# EasyEDA Pro project H7MS-H735-R4B-delivery-20261017.epro, schematic H7MS_CORE_H735_A1_核心板原理图, sheets 8 to 10 of 11

## Sheets
8 C07_板间连接器与测试点: Create Date: 2026-10-17; Update Date: 2026-10-17; Version: Draft_0.10
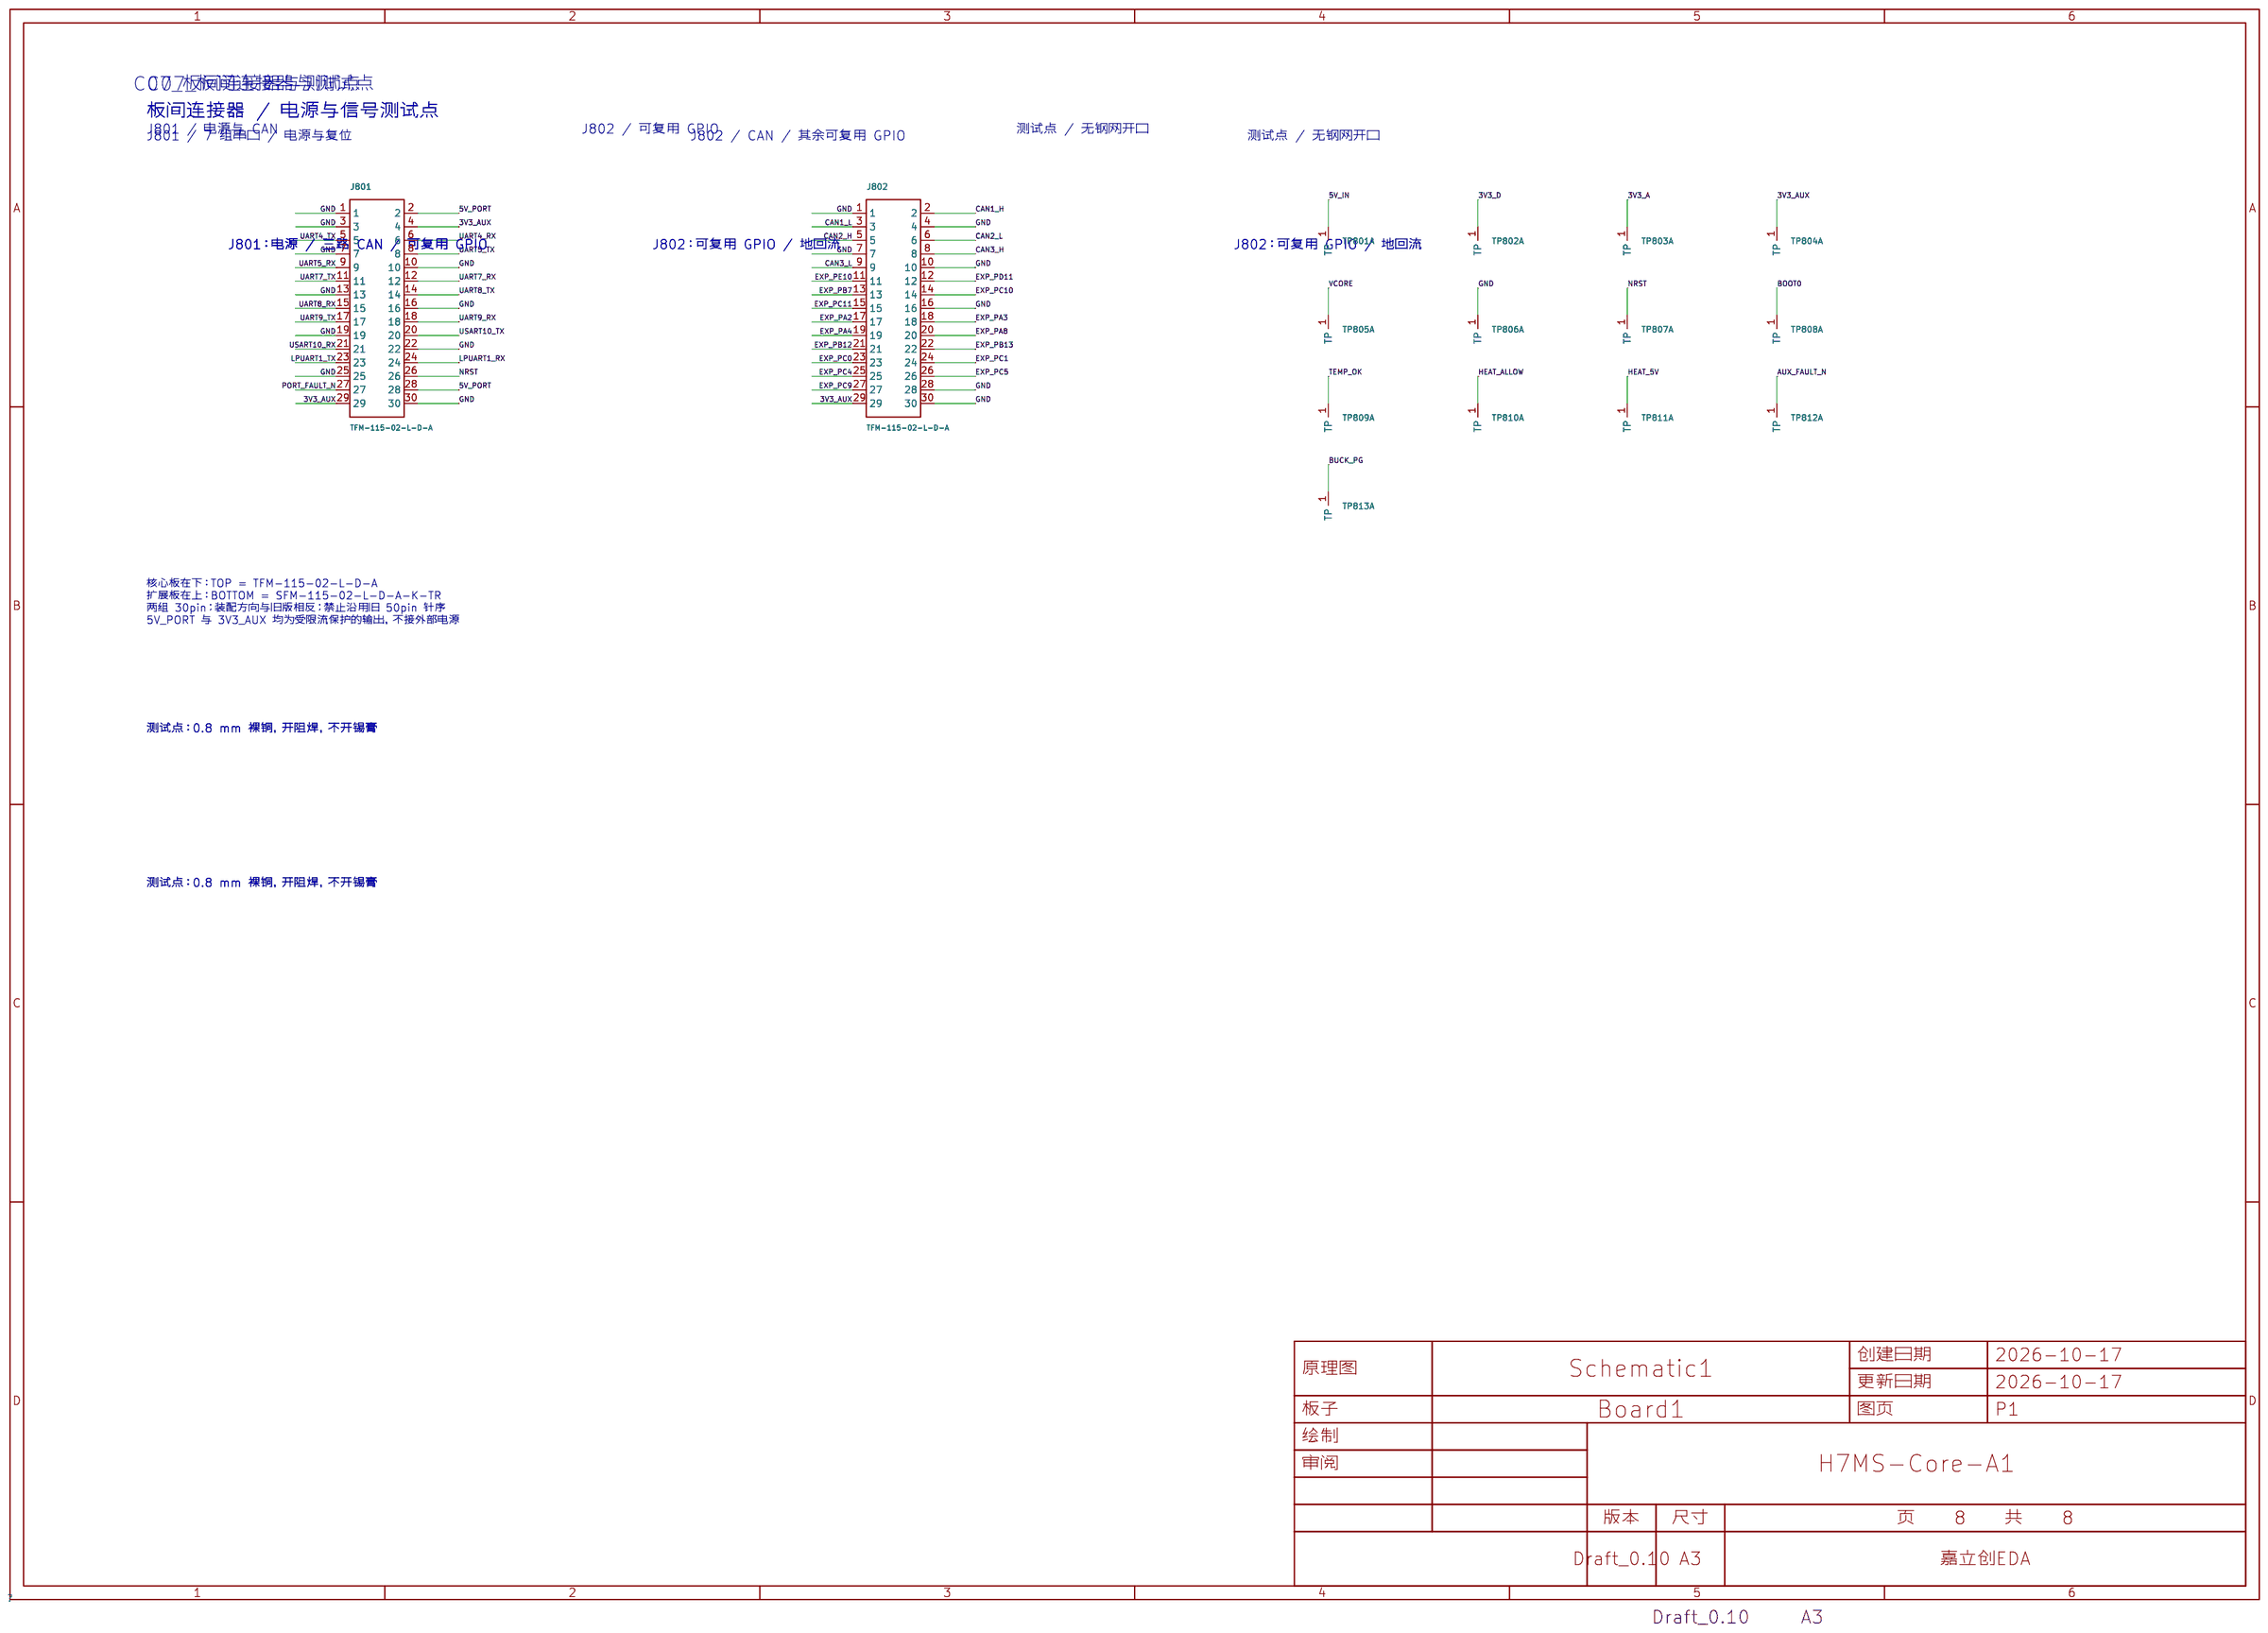
[diagram p7: C07_板间连接器与测试点]
9 C08_四组UART直立接口: Board Name: CORE_H735核心板; Create Date: 2026-10-17; Schematic Name: H7MS_CORE_H735_A1_核心板原理图; Update Date: 2026-10-17; Page Size: A4; Version: V1.0
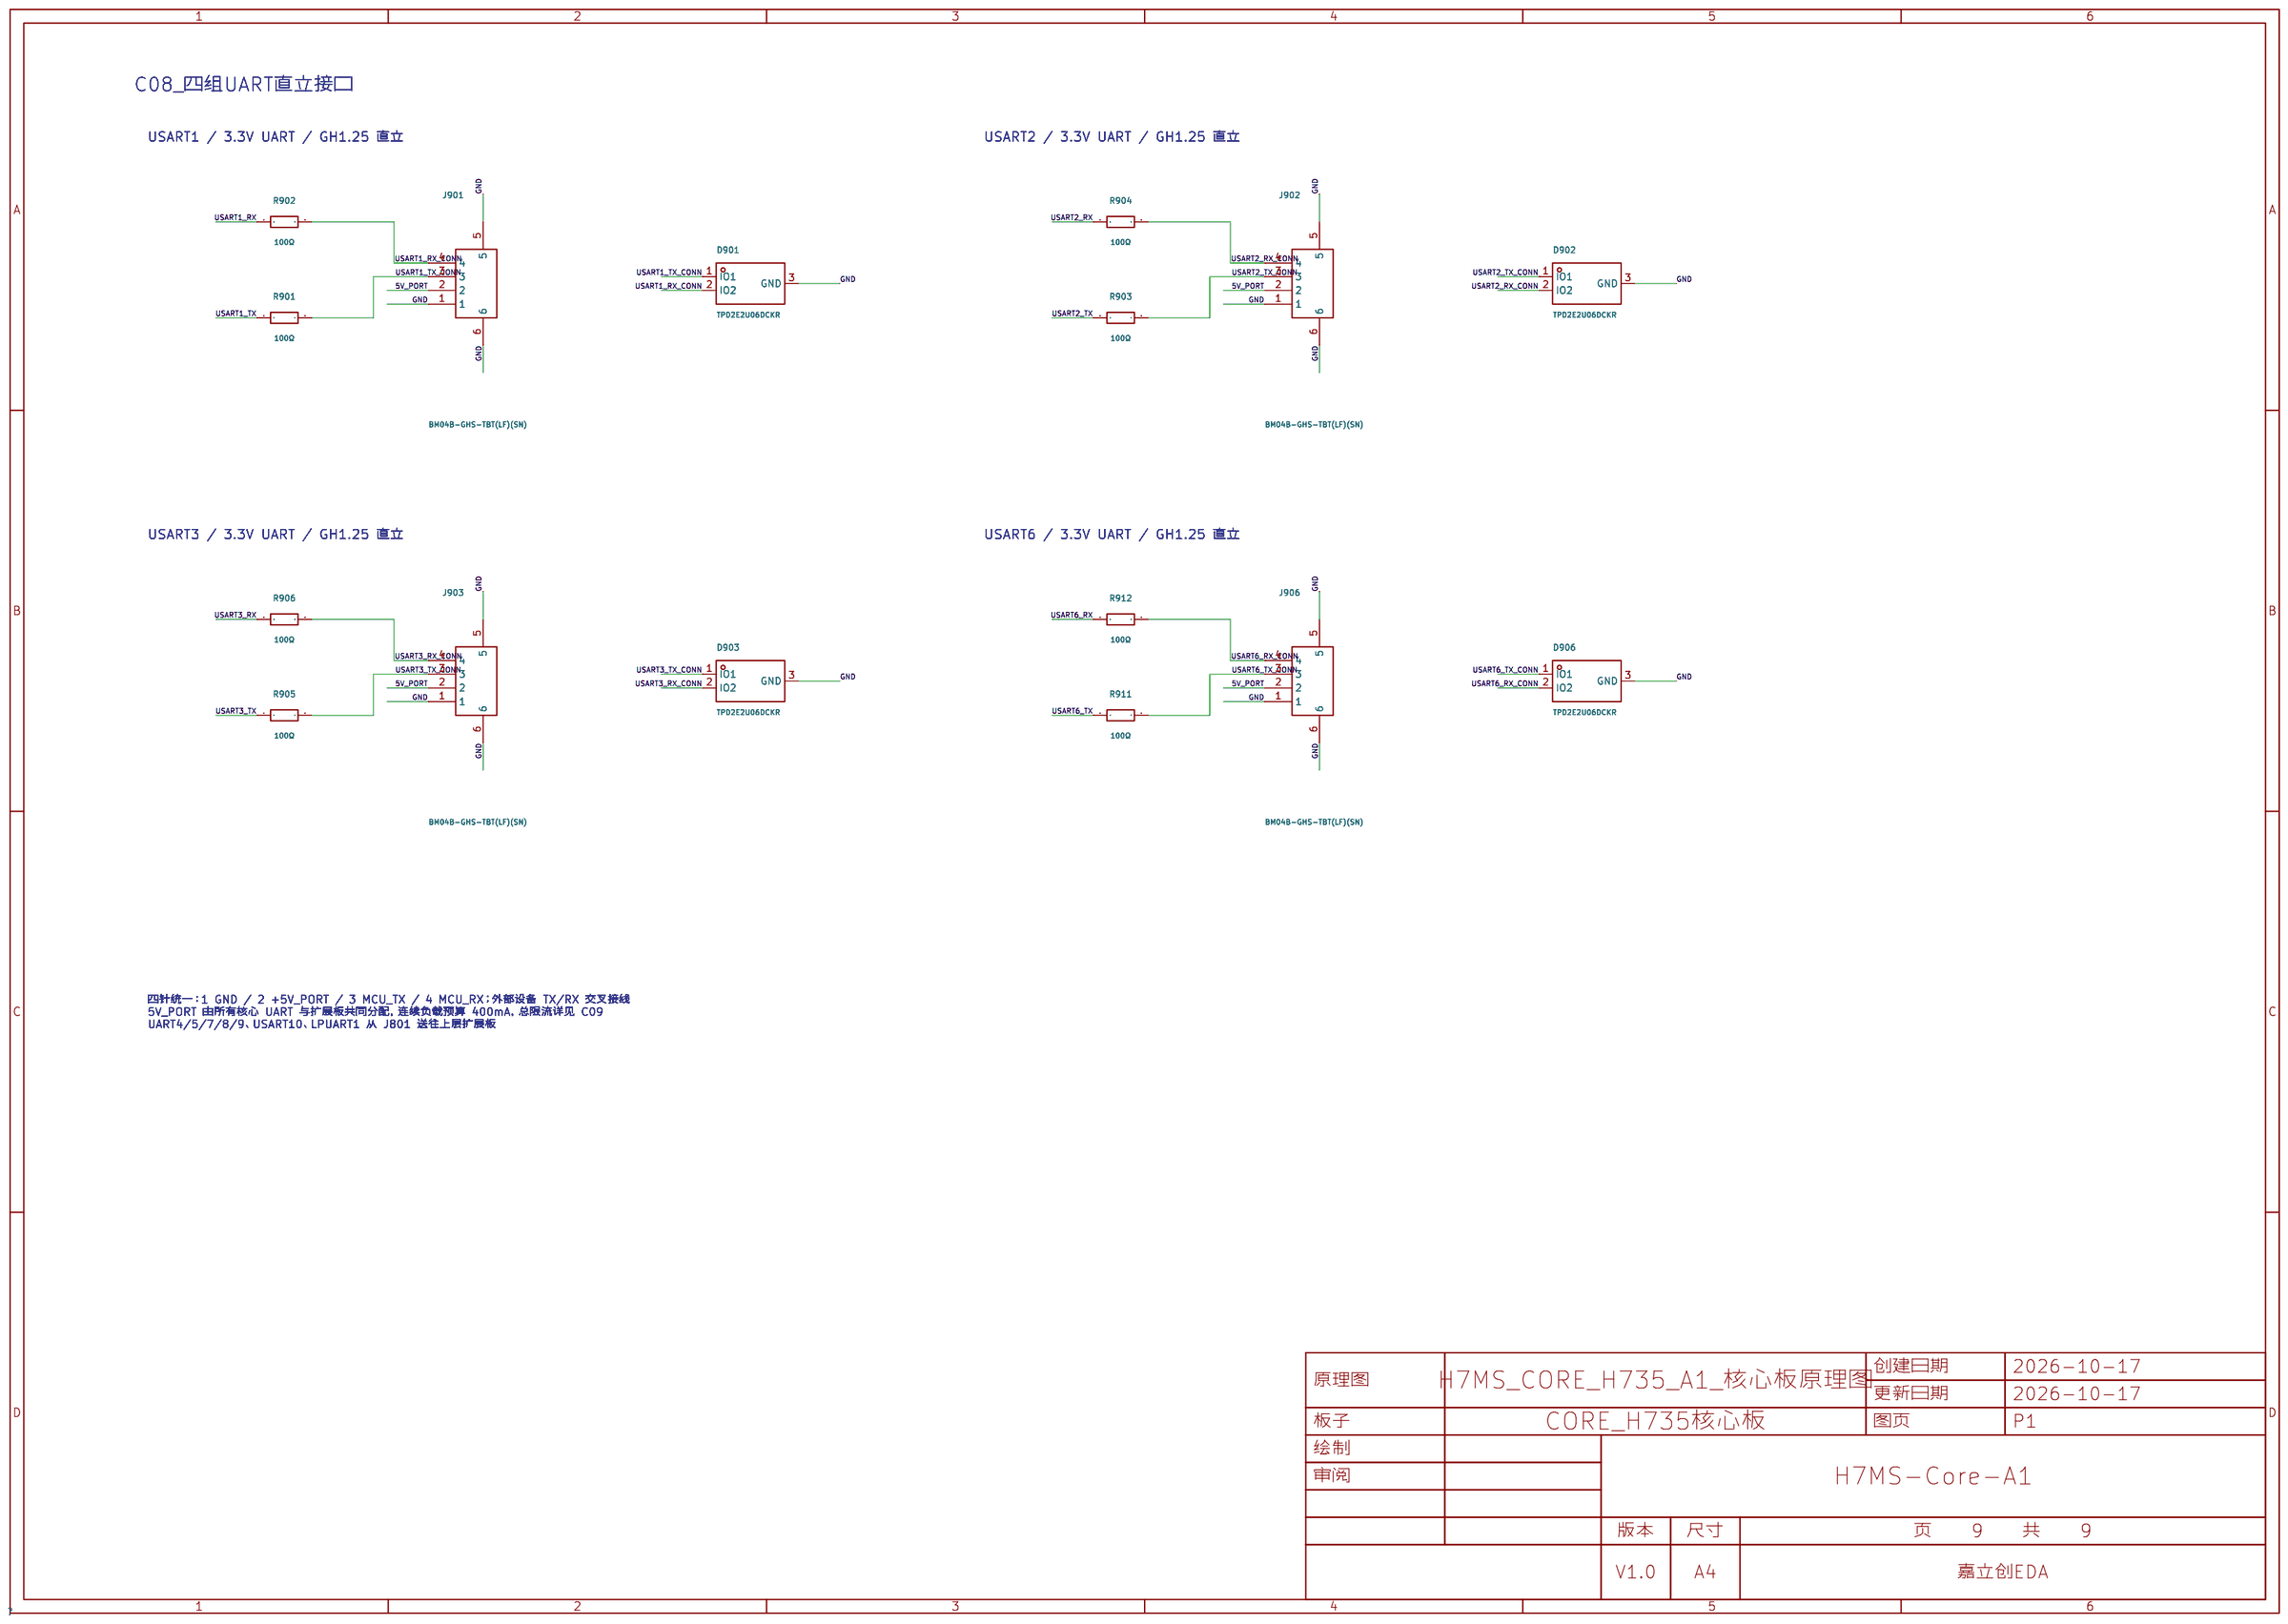
[diagram p8: C08_四组UART直立接口]
10 C09_SPI_I2C自定义排针与接口供电: Board Name: CORE_H735核心板; Create Date: 2026-10-17; Schematic Name: H7MS_CORE_H735_A1_核心板原理图; Update Date: 2026-10-17; Page Size: A4; Version: V1.0
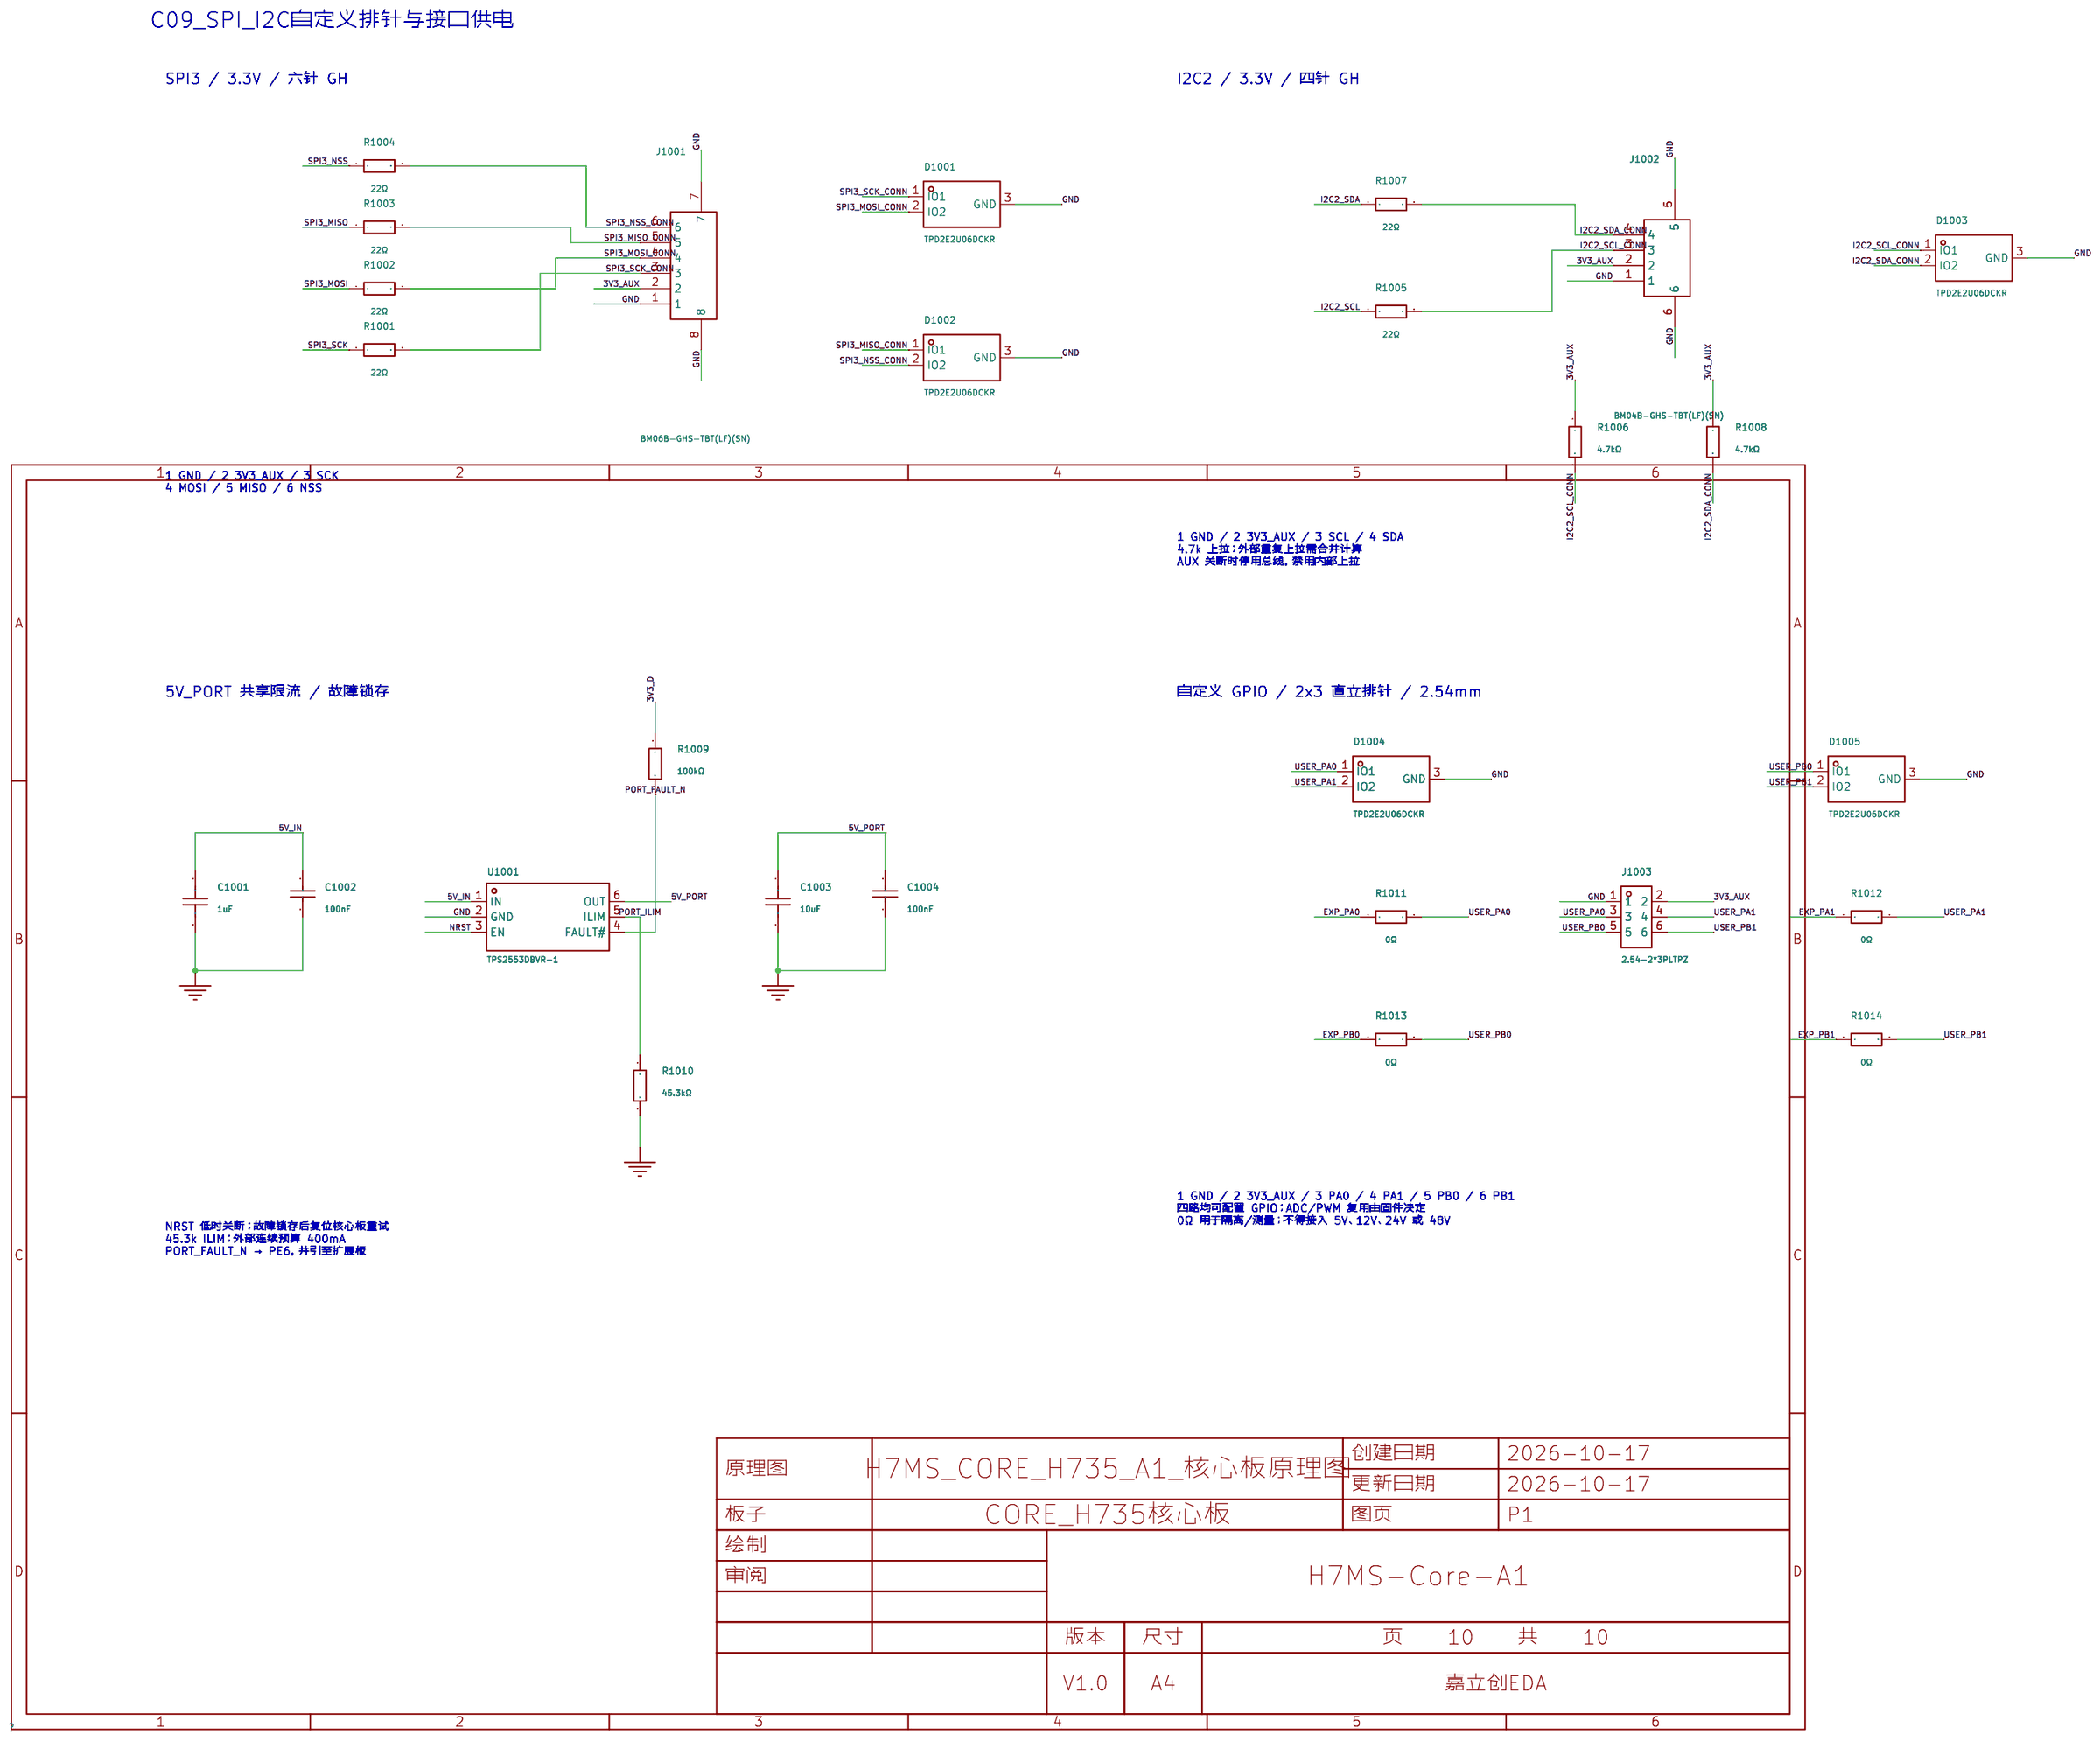
[diagram p9: C09_SPI_I2C自定义排针与接口供电]

## Parts
sheet C07_板间连接器与测试点
J801  TFM-115-02-L-D-A  [CONN-SMD_TFM-115-02-L-D-A]
J802  TFM-115-02-L-D-A  [CONN-SMD_TFM-115-02-L-D-A]
TP801  PCB_TP_0.8  [H7MS_TP_0p8_NOMASKPASTE]  (section 1)  (no BOM)
TP802  PCB_TP_0.8  [H7MS_TP_0p8_NOMASKPASTE]  (section 1)  (no BOM)
TP803  PCB_TP_0.8  [H7MS_TP_0p8_NOMASKPASTE]  (section 1)  (no BOM)
TP804  PCB_TP_0.8  [H7MS_TP_0p8_NOMASKPASTE]  (section 1)  (no BOM)
TP805  PCB_TP_0.8  [H7MS_TP_0p8_NOMASKPASTE]  (section 1)  (no BOM)
TP806  PCB_TP_0.8  [H7MS_TP_0p8_NOMASKPASTE]  (section 1)  (no BOM)
TP807  PCB_TP_0.8  [H7MS_TP_0p8_NOMASKPASTE]  (section 1)  (no BOM)
TP808  PCB_TP_0.8  [H7MS_TP_0p8_NOMASKPASTE]  (section 1)  (no BOM)
TP809  PCB_TP_0.8  [H7MS_TP_0p8_NOMASKPASTE]  (section 1)  (no BOM)
TP810  PCB_TP_0.8  [H7MS_TP_0p8_NOMASKPASTE]  (section 1)  (no BOM)
TP811  PCB_TP_0.8  [H7MS_TP_0p8_NOMASKPASTE]  (section 1)  (no BOM)
TP812  PCB_TP_0.8  [H7MS_TP_0p8_NOMASKPASTE]  (section 1)  (no BOM)
TP813  PCB_TP_0.8  [H7MS_TP_0p8_NOMASKPASTE]  (section 1)  (no BOM)
sheet C08_四组UART直立接口
D901  TPD2E2U06DCKR  [SC-70-3_L2.0-W1.3-P0.65-LS2.1-BL]
D902  TPD2E2U06DCKR  [SC-70-3_L2.0-W1.3-P0.65-LS2.1-BL]
D903  TPD2E2U06DCKR  [SC-70-3_L2.0-W1.3-P0.65-LS2.1-BL]
D906  TPD2E2U06DCKR  [SC-70-3_L2.0-W1.3-P0.65-LS2.1-BL]
J901  BM04B-GHS-TBT(LF)(SN)  [CONN-SMD_4P-P1.25_BM04B-GHS-TBT-LF-SN]
J902  BM04B-GHS-TBT(LF)(SN)  [CONN-SMD_4P-P1.25_BM04B-GHS-TBT-LF-SN]
J903  BM04B-GHS-TBT(LF)(SN)  [CONN-SMD_4P-P1.25_BM04B-GHS-TBT-LF-SN]
J906  BM04B-GHS-TBT(LF)(SN)  [CONN-SMD_4P-P1.25_BM04B-GHS-TBT-LF-SN]
R901  100Ω  [R0402]
R902  100Ω  [R0402]
R903  100Ω  [R0402]
R904  100Ω  [R0402]
R905  100Ω  [R0402]
R906  100Ω  [R0402]
R911  100Ω  [R0402]
R912  100Ω  [R0402]
sheet C09_SPI_I2C自定义排针与接口供电
C1001  1uF  [C0603]
C1002  100nF  [C0402]
C1003  10uF  [C0805]
C1004  100nF  [C0402]
D1001  TPD2E2U06DCKR  [SC-70-3_L2.0-W1.3-P0.65-LS2.1-BL]
D1002  TPD2E2U06DCKR  [SC-70-3_L2.0-W1.3-P0.65-LS2.1-BL]
D1003  TPD2E2U06DCKR  [SC-70-3_L2.0-W1.3-P0.65-LS2.1-BL]
D1004  TPD2E2U06DCKR  [SC-70-3_L2.0-W1.3-P0.65-LS2.1-BL]
D1005  TPD2E2U06DCKR  [SC-70-3_L2.0-W1.3-P0.65-LS2.1-BL]
J1001  BM06B-GHS-TBT(LF)(SN)  [CONN-SMD_6P-P1.25_BM06B-GHS-TBT-LF-SN-N]
J1002  BM04B-GHS-TBT(LF)(SN)  [CONN-SMD_4P-P1.25_BM04B-GHS-TBT-LF-SN]
J1003  2.54-2*3PLTPZ  [HDR-SMD_6P-P2.54-V-M-R2-C3-LS7.5-2]
R1001  22Ω  [R0402]
R1002  22Ω  [R0402]
R1003  22Ω  [R0402]
R1004  22Ω  [R0402]
R1005  22Ω  [R0402]
R1006  4.7kΩ  [R0402]
R1007  22Ω  [R0402]
R1008  4.7kΩ  [R0402]
R1009  100kΩ  [R0402]
R1010  45.3kΩ  [R0402]
R1011  0Ω  [R0402]
R1012  0Ω  [R0402]
R1013  0Ω  [R0402]
R1014  0Ω  [R0402]
U1001  TPS2553DBVR-1  [SOT-23-6_L2.9-W1.6-P0.95-LS2.8-BL]

## Library data of the parts
J801 = TFM-115-02-L-D-A: 插针结构:2x15P;间距:1.27mm;安装方式:立贴;总PIN数:30P;排数:2;每排PIN数:15;行距:1.27mm;额定电流:3.2A;触头材质:磷青铜;触头镀层:锡;工作温度:-55℃~+125℃;; LCSC Part Name: 2x15P 间距:1.27mm 立贴; Supplier Part: C5714577; Manufacturer: SAMTEC; Supplier Footprint: SMD,P=1.27mm; JLCPCB Part Class: Extended Part; Datasheet: https://item.szlcsc.com/datasheet/TFM-115-02-L-D-A/6638434.html; Supplier: LCSC; Pins Structure: 2x15P; Pitch: 1.27mm; Mounting Type: 立贴; Number of Pins: 30P; Number of Rows: 2; Number of PINs Per Row: 15; Row Spacing: 1.27mm; Current Rating: 3.2A; Contact Material: 磷青铜; Contact Plating: 锡; Operating Temperature: -55℃~+125℃; Voltage Rating: 250V; Plastic Material: LCP; Flame Retardant Rating: UL94V-0; Color: 黑色; Z-Height of the Board: 5.72mm; X-Length of Bottom Edge on Board (Spacing Line): 22.23mm; Y-Width of Bottom Edge on Board: 5.72mm; H7MS_Function: J1; H7MS_Revision: R4; H7MS_Assembly: FIT
J802 = TFM-115-02-L-D-A: 插针结构:2x15P;间距:1.27mm;安装方式:立贴;总PIN数:30P;排数:2;每排PIN数:15;行距:1.27mm;额定电流:3.2A;触头材质:磷青铜;触头镀层:锡;工作温度:-55℃~+125℃;; LCSC Part Name: 2x15P 间距:1.27mm 立贴; Supplier Part: C5714577; Manufacturer: SAMTEC; Supplier Footprint: SMD,P=1.27mm; JLCPCB Part Class: Extended Part; Datasheet: https://item.szlcsc.com/datasheet/TFM-115-02-L-D-A/6638434.html; Supplier: LCSC; Pins Structure: 2x15P; Pitch: 1.27mm; Mounting Type: 立贴; Number of Pins: 30P; Number of Rows: 2; Number of PINs Per Row: 15; Row Spacing: 1.27mm; Current Rating: 3.2A; Contact Material: 磷青铜; Contact Plating: 锡; Operating Temperature: -55℃~+125℃; Voltage Rating: 250V; Plastic Material: LCP; Flame Retardant Rating: UL94V-0; Color: 黑色; Z-Height of the Board: 5.72mm; X-Length of Bottom Edge on Board (Spacing Line): 22.23mm; Y-Width of Bottom Edge on Board: 5.72mm; H7MS_Function: J2; H7MS_Revision: R4; H7MS_Assembly: FIT
TP801 = H7MS_PCB_TP_0.8: PCB copper feature, no purchased part; Function: TP_5V_IN; H7MS_Function: TP_5V_IN
TP802 = H7MS_PCB_TP_0.8: PCB copper feature, no purchased part; Function: TP_3V3_D; H7MS_Function: TP_3V3_D
TP803 = H7MS_PCB_TP_0.8: PCB copper feature, no purchased part; Function: TP_3V3_A; H7MS_Function: TP_3V3_A
TP804 = H7MS_PCB_TP_0.8: PCB copper feature, no purchased part; Function: TP_3V3_AUX; H7MS_Function: TP_3V3_AUX
TP805 = H7MS_PCB_TP_0.8: PCB copper feature, no purchased part; Function: TP_VCORE; H7MS_Function: TP_VCORE
TP806 = H7MS_PCB_TP_0.8: PCB copper feature, no purchased part; Function: TP_GND; H7MS_Function: TP_GND
TP807 = H7MS_PCB_TP_0.8: PCB copper feature, no purchased part; Function: TP_NRST; H7MS_Function: TP_NRST
TP808 = H7MS_PCB_TP_0.8: PCB copper feature, no purchased part; Function: TP_BOOT0; H7MS_Function: TP_BOOT0
TP809 = H7MS_PCB_TP_0.8: PCB copper feature, no purchased part; Function: TP_TEMP_OK; H7MS_Function: TP_TEMP_OK
TP810 = H7MS_PCB_TP_0.8: PCB copper feature, no purchased part; Function: TP_HEAT_ALLOW; H7MS_Function: TP_HEAT_ALLOW
TP811 = H7MS_PCB_TP_0.8: PCB copper feature, no purchased part; Function: TP_HEAT_5V; H7MS_Function: TP_HEAT_5V
TP812 = H7MS_PCB_TP_0.8: PCB copper feature, no purchased part; Function: TP_AUX_FAULT_N; H7MS_Function: TP_AUX_FAULT_N
TP813 = H7MS_PCB_TP_0.8: PCB copper feature, no purchased part; Function: TP_BUCK_PG; H7MS_Function: TP_BUCK_PG
D901 = TPD2E2U06DCKR: 极性:双向;反向截止电压(Vrwm):5.5V;钳位电压:12.4V;峰值脉冲电流(Ipp):5.5A@8/20us;峰值脉冲功率(Ppp):75W@8/20us;击穿电压(VBR):6.5V;; LCSC Part Name: 双向TVS 5.5V截止 峰值浪涌电流：5.5A@8/20us; Supplier Part: C1855726; Manufacturer: TI(德州仪器); Supplier Footprint: SC-70-3; JLCPCB Part Class: Extended Part; Datasheet: https://www.ti.com/cn/lit/ds/symlink/tpd2e2u06.pdf; Supplier: LCSC; Polarity: 双向; Reverse Stand-Off Voltage (Vrwm): 5.5V; Clamping Voltage: 12.4V; Peak Pulse Current (Ipp): 5.5A@8/20us; Peak Pulse Power Dissipation (Ppp): 75W@8/20us; Voltage - Breakdown: 6.5V; Reverse Leakage Current (Ir): 10nA; Number of Channels: 双路; Operating Temperature: -40℃~+125℃; level of protection: IEC 61000-4-5；IEC 61000-4-2; Type: TVS; Junction Capacitance: 1.5pF; H7MS_Function: D_USART1; H7MS_Revision: R4; H7MS_Assembly: FIT
D902 = TPD2E2U06DCKR: 极性:双向;反向截止电压(Vrwm):5.5V;钳位电压:12.4V;峰值脉冲电流(Ipp):5.5A@8/20us;峰值脉冲功率(Ppp):75W@8/20us;击穿电压(VBR):6.5V;; LCSC Part Name: 双向TVS 5.5V截止 峰值浪涌电流：5.5A@8/20us; Supplier Part: C1855726; Manufacturer: TI(德州仪器); Supplier Footprint: SC-70-3; JLCPCB Part Class: Extended Part; Datasheet: https://www.ti.com/cn/lit/ds/symlink/tpd2e2u06.pdf; Supplier: LCSC; Polarity: 双向; Reverse Stand-Off Voltage (Vrwm): 5.5V; Clamping Voltage: 12.4V; Peak Pulse Current (Ipp): 5.5A@8/20us; Peak Pulse Power Dissipation (Ppp): 75W@8/20us; Voltage - Breakdown: 6.5V; Reverse Leakage Current (Ir): 10nA; Number of Channels: 双路; Operating Temperature: -40℃~+125℃; level of protection: IEC 61000-4-5；IEC 61000-4-2; Type: TVS; Junction Capacitance: 1.5pF; H7MS_Function: D_USART2; H7MS_Revision: R4; H7MS_Assembly: FIT
D903 = TPD2E2U06DCKR: 极性:双向;反向截止电压(Vrwm):5.5V;钳位电压:12.4V;峰值脉冲电流(Ipp):5.5A@8/20us;峰值脉冲功率(Ppp):75W@8/20us;击穿电压(VBR):6.5V;; LCSC Part Name: 双向TVS 5.5V截止 峰值浪涌电流：5.5A@8/20us; Supplier Part: C1855726; Manufacturer: TI(德州仪器); Supplier Footprint: SC-70-3; JLCPCB Part Class: Extended Part; Datasheet: https://www.ti.com/cn/lit/ds/symlink/tpd2e2u06.pdf; Supplier: LCSC; Polarity: 双向; Reverse Stand-Off Voltage (Vrwm): 5.5V; Clamping Voltage: 12.4V; Peak Pulse Current (Ipp): 5.5A@8/20us; Peak Pulse Power Dissipation (Ppp): 75W@8/20us; Voltage - Breakdown: 6.5V; Reverse Leakage Current (Ir): 10nA; Number of Channels: 双路; Operating Temperature: -40℃~+125℃; level of protection: IEC 61000-4-5；IEC 61000-4-2; Type: TVS; Junction Capacitance: 1.5pF; H7MS_Function: D_USART3; H7MS_Revision: R4; H7MS_Assembly: FIT
D906 = TPD2E2U06DCKR: 极性:双向;反向截止电压(Vrwm):5.5V;钳位电压:12.4V;峰值脉冲电流(Ipp):5.5A@8/20us;峰值脉冲功率(Ppp):75W@8/20us;击穿电压(VBR):6.5V;; LCSC Part Name: 双向TVS 5.5V截止 峰值浪涌电流：5.5A@8/20us; Supplier Part: C1855726; Manufacturer: TI(德州仪器); Supplier Footprint: SC-70-3; JLCPCB Part Class: Extended Part; Datasheet: https://www.ti.com/cn/lit/ds/symlink/tpd2e2u06.pdf; Supplier: LCSC; Polarity: 双向; Reverse Stand-Off Voltage (Vrwm): 5.5V; Clamping Voltage: 12.4V; Peak Pulse Current (Ipp): 5.5A@8/20us; Peak Pulse Power Dissipation (Ppp): 75W@8/20us; Voltage - Breakdown: 6.5V; Reverse Leakage Current (Ir): 10nA; Number of Channels: 双路; Operating Temperature: -40℃~+125℃; level of protection: IEC 61000-4-5；IEC 61000-4-2; Type: TVS; Junction Capacitance: 1.5pF; H7MS_Function: D_USART6; H7MS_Revision: R4; H7MS_Assembly: FIT
J901 = BM04B-GHS-TBT(LF)(SN): 插针结构:1x4P;间距:1.25mm;安装方式:立贴;参考系列:GH;总PIN数:4P;排数:1;每排PIN数:4;行距:-;额定电流:1A;触头材质:磷青铜;触头镀层:锡;工作温度:-25℃~+85℃;; LCSC Part Name: 1x4P 间距:1.25mm 立贴 系列:GH; Supplier Part: C161692; Manufacturer: JST; Supplier Footprint: SMD,P=1.25mm; JLCPCB Part Class: Extended Part; Datasheet: https://item.szlcsc.com/datasheet/BM04B-GHS-TBT(LF)(SN)/173073.html; Supplier: LCSC; Pins Structure: 1x4P; Pitch: 1.25mm; Mounting Type: 立贴; Reference Series: GH; Number of Pins: 4P; Number of Rows: 1; Number of PINs Per Row: 4; Current Rating: 1A; Contact Material: 磷青铜; Contact Plating: 锡; Operating Temperature: -25℃~+85℃; Voltage Rating: 50V; Plastic Material: PA9T; Flame Retardant Rating: UL94V-0; Supplementary Features: 辅助焊脚; Color: 白色; Z-Height of the Board: 4.05mm; X-Length of Bottom Edge on Board (Spacing Line): 8.25mm; Y-Width of Bottom Edge on Board: 4.32mm; H7MS_Function: J_USART1; H7MS_Revision: R4; H7MS_Assembly: FIT
J902 = BM04B-GHS-TBT(LF)(SN): 插针结构:1x4P;间距:1.25mm;安装方式:立贴;参考系列:GH;总PIN数:4P;排数:1;每排PIN数:4;行距:-;额定电流:1A;触头材质:磷青铜;触头镀层:锡;工作温度:-25℃~+85℃;; LCSC Part Name: 1x4P 间距:1.25mm 立贴 系列:GH; Supplier Part: C161692; Manufacturer: JST; Supplier Footprint: SMD,P=1.25mm; JLCPCB Part Class: Extended Part; Datasheet: https://item.szlcsc.com/datasheet/BM04B-GHS-TBT(LF)(SN)/173073.html; Supplier: LCSC; Pins Structure: 1x4P; Pitch: 1.25mm; Mounting Type: 立贴; Reference Series: GH; Number of Pins: 4P; Number of Rows: 1; Number of PINs Per Row: 4; Current Rating: 1A; Contact Material: 磷青铜; Contact Plating: 锡; Operating Temperature: -25℃~+85℃; Voltage Rating: 50V; Plastic Material: PA9T; Flame Retardant Rating: UL94V-0; Supplementary Features: 辅助焊脚; Color: 白色; Z-Height of the Board: 4.05mm; X-Length of Bottom Edge on Board (Spacing Line): 8.25mm; Y-Width of Bottom Edge on Board: 4.32mm; H7MS_Function: J_USART2; H7MS_Revision: R4; H7MS_Assembly: FIT
J903 = BM04B-GHS-TBT(LF)(SN): 插针结构:1x4P;间距:1.25mm;安装方式:立贴;参考系列:GH;总PIN数:4P;排数:1;每排PIN数:4;行距:-;额定电流:1A;触头材质:磷青铜;触头镀层:锡;工作温度:-25℃~+85℃;; LCSC Part Name: 1x4P 间距:1.25mm 立贴 系列:GH; Supplier Part: C161692; Manufacturer: JST; Supplier Footprint: SMD,P=1.25mm; JLCPCB Part Class: Extended Part; Datasheet: https://item.szlcsc.com/datasheet/BM04B-GHS-TBT(LF)(SN)/173073.html; Supplier: LCSC; Pins Structure: 1x4P; Pitch: 1.25mm; Mounting Type: 立贴; Reference Series: GH; Number of Pins: 4P; Number of Rows: 1; Number of PINs Per Row: 4; Current Rating: 1A; Contact Material: 磷青铜; Contact Plating: 锡; Operating Temperature: -25℃~+85℃; Voltage Rating: 50V; Plastic Material: PA9T; Flame Retardant Rating: UL94V-0; Supplementary Features: 辅助焊脚; Color: 白色; Z-Height of the Board: 4.05mm; X-Length of Bottom Edge on Board (Spacing Line): 8.25mm; Y-Width of Bottom Edge on Board: 4.32mm; H7MS_Function: J_USART3; H7MS_Revision: R4; H7MS_Assembly: FIT
J906 = BM04B-GHS-TBT(LF)(SN): 插针结构:1x4P;间距:1.25mm;安装方式:立贴;参考系列:GH;总PIN数:4P;排数:1;每排PIN数:4;行距:-;额定电流:1A;触头材质:磷青铜;触头镀层:锡;工作温度:-25℃~+85℃;; LCSC Part Name: 1x4P 间距:1.25mm 立贴 系列:GH; Supplier Part: C161692; Manufacturer: JST; Supplier Footprint: SMD,P=1.25mm; JLCPCB Part Class: Extended Part; Datasheet: https://item.szlcsc.com/datasheet/BM04B-GHS-TBT(LF)(SN)/173073.html; Supplier: LCSC; Pins Structure: 1x4P; Pitch: 1.25mm; Mounting Type: 立贴; Reference Series: GH; Number of Pins: 4P; Number of Rows: 1; Number of PINs Per Row: 4; Current Rating: 1A; Contact Material: 磷青铜; Contact Plating: 锡; Operating Temperature: -25℃~+85℃; Voltage Rating: 50V; Plastic Material: PA9T; Flame Retardant Rating: UL94V-0; Supplementary Features: 辅助焊脚; Color: 白色; Z-Height of the Board: 4.05mm; X-Length of Bottom Edge on Board (Spacing Line): 8.25mm; Y-Width of Bottom Edge on Board: 4.32mm; H7MS_Function: J_USART6; H7MS_Revision: R4; H7MS_Assembly: FIT
R901 = RC0402FR-07100RL: 电阻类型:厚膜电阻;阻值:100Ω;精度:±1%;功率:62.5mW;工作电压:50V;温度系数:±100ppm/℃;; LCSC Part Name: 厚膜电阻 100Ω ±1% 62.5mW; Supplier Part: C106232; Manufacturer: YAGEO(国巨); Supplier Footprint: 0402; JLCPCB Part Class: Extended Part; Datasheet: https://item.szlcsc.com/datasheet/RC0402FR-07100RL/107447.html; Supplier: LCSC; Type: 厚膜电阻; Tolerance: ±1%; Power(Watts): 62.5mW; Voltage-Supply(Max): 50V; Temperature Coefficient: ±100ppm/℃; Operating Temperature: -55℃~+155℃; H7MS_Function: R_USART1_TX; H7MS_Revision: R4; H7MS_Assembly: FIT
R902 = RC0402FR-07100RL: 电阻类型:厚膜电阻;阻值:100Ω;精度:±1%;功率:62.5mW;工作电压:50V;温度系数:±100ppm/℃;; LCSC Part Name: 厚膜电阻 100Ω ±1% 62.5mW; Supplier Part: C106232; Manufacturer: YAGEO(国巨); Supplier Footprint: 0402; JLCPCB Part Class: Extended Part; Datasheet: https://item.szlcsc.com/datasheet/RC0402FR-07100RL/107447.html; Supplier: LCSC; Type: 厚膜电阻; Tolerance: ±1%; Power(Watts): 62.5mW; Voltage-Supply(Max): 50V; Temperature Coefficient: ±100ppm/℃; Operating Temperature: -55℃~+155℃; H7MS_Function: R_USART1_RX; H7MS_Revision: R4; H7MS_Assembly: FIT
R903 = RC0402FR-07100RL: 电阻类型:厚膜电阻;阻值:100Ω;精度:±1%;功率:62.5mW;工作电压:50V;温度系数:±100ppm/℃;; LCSC Part Name: 厚膜电阻 100Ω ±1% 62.5mW; Supplier Part: C106232; Manufacturer: YAGEO(国巨); Supplier Footprint: 0402; JLCPCB Part Class: Extended Part; Datasheet: https://item.szlcsc.com/datasheet/RC0402FR-07100RL/107447.html; Supplier: LCSC; Type: 厚膜电阻; Tolerance: ±1%; Power(Watts): 62.5mW; Voltage-Supply(Max): 50V; Temperature Coefficient: ±100ppm/℃; Operating Temperature: -55℃~+155℃; H7MS_Function: R_USART2_TX; H7MS_Revision: R4; H7MS_Assembly: FIT
R904 = RC0402FR-07100RL: 电阻类型:厚膜电阻;阻值:100Ω;精度:±1%;功率:62.5mW;工作电压:50V;温度系数:±100ppm/℃;; LCSC Part Name: 厚膜电阻 100Ω ±1% 62.5mW; Supplier Part: C106232; Manufacturer: YAGEO(国巨); Supplier Footprint: 0402; JLCPCB Part Class: Extended Part; Datasheet: https://item.szlcsc.com/datasheet/RC0402FR-07100RL/107447.html; Supplier: LCSC; Type: 厚膜电阻; Tolerance: ±1%; Power(Watts): 62.5mW; Voltage-Supply(Max): 50V; Temperature Coefficient: ±100ppm/℃; Operating Temperature: -55℃~+155℃; H7MS_Function: R_USART2_RX; H7MS_Revision: R4; H7MS_Assembly: FIT
R905 = RC0402FR-07100RL: 电阻类型:厚膜电阻;阻值:100Ω;精度:±1%;功率:62.5mW;工作电压:50V;温度系数:±100ppm/℃;; LCSC Part Name: 厚膜电阻 100Ω ±1% 62.5mW; Supplier Part: C106232; Manufacturer: YAGEO(国巨); Supplier Footprint: 0402; JLCPCB Part Class: Extended Part; Datasheet: https://item.szlcsc.com/datasheet/RC0402FR-07100RL/107447.html; Supplier: LCSC; Type: 厚膜电阻; Tolerance: ±1%; Power(Watts): 62.5mW; Voltage-Supply(Max): 50V; Temperature Coefficient: ±100ppm/℃; Operating Temperature: -55℃~+155℃; H7MS_Function: R_USART3_TX; H7MS_Revision: R4; H7MS_Assembly: FIT
R906 = RC0402FR-07100RL: 电阻类型:厚膜电阻;阻值:100Ω;精度:±1%;功率:62.5mW;工作电压:50V;温度系数:±100ppm/℃;; LCSC Part Name: 厚膜电阻 100Ω ±1% 62.5mW; Supplier Part: C106232; Manufacturer: YAGEO(国巨); Supplier Footprint: 0402; JLCPCB Part Class: Extended Part; Datasheet: https://item.szlcsc.com/datasheet/RC0402FR-07100RL/107447.html; Supplier: LCSC; Type: 厚膜电阻; Tolerance: ±1%; Power(Watts): 62.5mW; Voltage-Supply(Max): 50V; Temperature Coefficient: ±100ppm/℃; Operating Temperature: -55℃~+155℃; H7MS_Function: R_USART3_RX; H7MS_Revision: R4; H7MS_Assembly: FIT
R911 = RC0402FR-07100RL: 电阻类型:厚膜电阻;阻值:100Ω;精度:±1%;功率:62.5mW;工作电压:50V;温度系数:±100ppm/℃;; LCSC Part Name: 厚膜电阻 100Ω ±1% 62.5mW; Supplier Part: C106232; Manufacturer: YAGEO(国巨); Supplier Footprint: 0402; JLCPCB Part Class: Extended Part; Datasheet: https://item.szlcsc.com/datasheet/RC0402FR-07100RL/107447.html; Supplier: LCSC; Type: 厚膜电阻; Tolerance: ±1%; Power(Watts): 62.5mW; Voltage-Supply(Max): 50V; Temperature Coefficient: ±100ppm/℃; Operating Temperature: -55℃~+155℃; H7MS_Function: R_USART6_TX; H7MS_Revision: R4; H7MS_Assembly: FIT
R912 = RC0402FR-07100RL: 电阻类型:厚膜电阻;阻值:100Ω;精度:±1%;功率:62.5mW;工作电压:50V;温度系数:±100ppm/℃;; LCSC Part Name: 厚膜电阻 100Ω ±1% 62.5mW; Supplier Part: C106232; Manufacturer: YAGEO(国巨); Supplier Footprint: 0402; JLCPCB Part Class: Extended Part; Datasheet: https://item.szlcsc.com/datasheet/RC0402FR-07100RL/107447.html; Supplier: LCSC; Type: 厚膜电阻; Tolerance: ±1%; Power(Watts): 62.5mW; Voltage-Supply(Max): 50V; Temperature Coefficient: ±100ppm/℃; Operating Temperature: -55℃~+155℃; H7MS_Function: R_USART6_RX; H7MS_Revision: R4; H7MS_Assembly: FIT
C1001 = C1608X7R1C105K080AC: 容值:1uF;精度:±10%;额定电压:16V;温度系数:X7R;; LCSC Part Name: 1uF ±10% 16V; Supplier Part: C2167399; Manufacturer: TDK; Supplier Footprint: 0603; JLCPCB Part Class: Extended Part; Datasheet: https://item.szlcsc.com/datasheet/C1608X7R1C105K080AC/2259451.html; Supplier: LCSC; Tolerance: ±10%; Voltage Rating: 16V; Temperature Coefficient: X7R; H7MS_Function: C_PORT_IN; H7MS_Revision: R4; H7MS_Assembly: FIT
C1002 = C1005X7R1H104K050BB: 容值:100nF;精度:±10%;额定电压:50V;温度系数:X7R;; LCSC Part Name: 100nF ±10% 50V; Supplier Part: C2181015; Manufacturer: TDK; Supplier Footprint: 0402; JLCPCB Part Class: Extended Part; Datasheet: https://item.szlcsc.com/datasheet/C1005X7R1H104K050BB/2273082.html; Supplier: LCSC; Tolerance: ±10%; Voltage Rating: 50V; Temperature Coefficient: X7R; H7MS_Function: C_PORT_IN_HF; H7MS_Revision: R4; H7MS_Assembly: FIT
C1003 = GRM21BR61E106KA73L: 容值:10uF;精度:±10%;额定电压:25V;温度系数:X5R;; LCSC Part Name: 10uF ±10% 25V; Supplier Part: C84416; Manufacturer: muRata(村田); Supplier Footprint: 0805; JLCPCB Part Class: Extended Part; Datasheet: https://item.szlcsc.com/datasheet/GRM21BR61E106KA73L/85586.html; Supplier: LCSC; Tolerance: ±10%; Voltage Rating: 25V; Temperature Coefficient: X5R; H7MS_Function: C_PORT_OUT; H7MS_Revision: R4; H7MS_Assembly: FIT
C1004 = C1005X7R1H104K050BB: 容值:100nF;精度:±10%;额定电压:50V;温度系数:X7R;; LCSC Part Name: 100nF ±10% 50V; Supplier Part: C2181015; Manufacturer: TDK; Supplier Footprint: 0402; JLCPCB Part Class: Extended Part; Datasheet: https://item.szlcsc.com/datasheet/C1005X7R1H104K050BB/2273082.html; Supplier: LCSC; Tolerance: ±10%; Voltage Rating: 50V; Temperature Coefficient: X7R; H7MS_Function: C_PORT_OUT_HF; H7MS_Revision: R4; H7MS_Assembly: FIT
D1001 = TPD2E2U06DCKR: 极性:双向;反向截止电压(Vrwm):5.5V;钳位电压:12.4V;峰值脉冲电流(Ipp):5.5A@8/20us;峰值脉冲功率(Ppp):75W@8/20us;击穿电压(VBR):6.5V;; LCSC Part Name: 双向TVS 5.5V截止 峰值浪涌电流：5.5A@8/20us; Supplier Part: C1855726; Manufacturer: TI(德州仪器); Supplier Footprint: SC-70-3; JLCPCB Part Class: Extended Part; Datasheet: https://www.ti.com/cn/lit/ds/symlink/tpd2e2u06.pdf; Supplier: LCSC; Polarity: 双向; Reverse Stand-Off Voltage (Vrwm): 5.5V; Clamping Voltage: 12.4V; Peak Pulse Current (Ipp): 5.5A@8/20us; Peak Pulse Power Dissipation (Ppp): 75W@8/20us; Voltage - Breakdown: 6.5V; Reverse Leakage Current (Ir): 10nA; Number of Channels: 双路; Operating Temperature: -40℃~+125℃; level of protection: IEC 61000-4-5；IEC 61000-4-2; Type: TVS; Junction Capacitance: 1.5pF; H7MS_Function: D_SPI3_A; H7MS_Revision: R4; H7MS_Assembly: FIT
D1002 = TPD2E2U06DCKR: 极性:双向;反向截止电压(Vrwm):5.5V;钳位电压:12.4V;峰值脉冲电流(Ipp):5.5A@8/20us;峰值脉冲功率(Ppp):75W@8/20us;击穿电压(VBR):6.5V;; LCSC Part Name: 双向TVS 5.5V截止 峰值浪涌电流：5.5A@8/20us; Supplier Part: C1855726; Manufacturer: TI(德州仪器); Supplier Footprint: SC-70-3; JLCPCB Part Class: Extended Part; Datasheet: https://www.ti.com/cn/lit/ds/symlink/tpd2e2u06.pdf; Supplier: LCSC; Polarity: 双向; Reverse Stand-Off Voltage (Vrwm): 5.5V; Clamping Voltage: 12.4V; Peak Pulse Current (Ipp): 5.5A@8/20us; Peak Pulse Power Dissipation (Ppp): 75W@8/20us; Voltage - Breakdown: 6.5V; Reverse Leakage Current (Ir): 10nA; Number of Channels: 双路; Operating Temperature: -40℃~+125℃; level of protection: IEC 61000-4-5；IEC 61000-4-2; Type: TVS; Junction Capacitance: 1.5pF; H7MS_Function: D_SPI3_B; H7MS_Revision: R4; H7MS_Assembly: FIT
D1003 = TPD2E2U06DCKR: 极性:双向;反向截止电压(Vrwm):5.5V;钳位电压:12.4V;峰值脉冲电流(Ipp):5.5A@8/20us;峰值脉冲功率(Ppp):75W@8/20us;击穿电压(VBR):6.5V;; LCSC Part Name: 双向TVS 5.5V截止 峰值浪涌电流：5.5A@8/20us; Supplier Part: C1855726; Manufacturer: TI(德州仪器); Supplier Footprint: SC-70-3; JLCPCB Part Class: Extended Part; Datasheet: https://www.ti.com/cn/lit/ds/symlink/tpd2e2u06.pdf; Supplier: LCSC; Polarity: 双向; Reverse Stand-Off Voltage (Vrwm): 5.5V; Clamping Voltage: 12.4V; Peak Pulse Current (Ipp): 5.5A@8/20us; Peak Pulse Power Dissipation (Ppp): 75W@8/20us; Voltage - Breakdown: 6.5V; Reverse Leakage Current (Ir): 10nA; Number of Channels: 双路; Operating Temperature: -40℃~+125℃; level of protection: IEC 61000-4-5；IEC 61000-4-2; Type: TVS; Junction Capacitance: 1.5pF; H7MS_Function: D_I2C2; H7MS_Revision: R4; H7MS_Assembly: FIT
D1004 = TPD2E2U06DCKR: 极性:双向;反向截止电压(Vrwm):5.5V;钳位电压:12.4V;峰值脉冲电流(Ipp):5.5A@8/20us;峰值脉冲功率(Ppp):75W@8/20us;击穿电压(VBR):6.5V;; LCSC Part Name: 双向TVS 5.5V截止 峰值浪涌电流：5.5A@8/20us; Supplier Part: C1855726; Manufacturer: TI(德州仪器); Supplier Footprint: SC-70-3; JLCPCB Part Class: Extended Part; Datasheet: https://www.ti.com/cn/lit/ds/symlink/tpd2e2u06.pdf; Supplier: LCSC; Polarity: 双向; Reverse Stand-Off Voltage (Vrwm): 5.5V; Clamping Voltage: 12.4V; Peak Pulse Current (Ipp): 5.5A@8/20us; Peak Pulse Power Dissipation (Ppp): 75W@8/20us; Voltage - Breakdown: 6.5V; Reverse Leakage Current (Ir): 10nA; Number of Channels: 双路; Operating Temperature: -40℃~+125℃; level of protection: IEC 61000-4-5；IEC 61000-4-2; Type: TVS; Junction Capacitance: 1.5pF; H7MS_Function: D_GPIO_A; H7MS_Revision: R4; H7MS_Assembly: FIT
D1005 = TPD2E2U06DCKR: 极性:双向;反向截止电压(Vrwm):5.5V;钳位电压:12.4V;峰值脉冲电流(Ipp):5.5A@8/20us;峰值脉冲功率(Ppp):75W@8/20us;击穿电压(VBR):6.5V;; LCSC Part Name: 双向TVS 5.5V截止 峰值浪涌电流：5.5A@8/20us; Supplier Part: C1855726; Manufacturer: TI(德州仪器); Supplier Footprint: SC-70-3; JLCPCB Part Class: Extended Part; Datasheet: https://www.ti.com/cn/lit/ds/symlink/tpd2e2u06.pdf; Supplier: LCSC; Polarity: 双向; Reverse Stand-Off Voltage (Vrwm): 5.5V; Clamping Voltage: 12.4V; Peak Pulse Current (Ipp): 5.5A@8/20us; Peak Pulse Power Dissipation (Ppp): 75W@8/20us; Voltage - Breakdown: 6.5V; Reverse Leakage Current (Ir): 10nA; Number of Channels: 双路; Operating Temperature: -40℃~+125℃; level of protection: IEC 61000-4-5；IEC 61000-4-2; Type: TVS; Junction Capacitance: 1.5pF; H7MS_Function: D_GPIO_B; H7MS_Revision: R4; H7MS_Assembly: FIT
J1001 = BM06B-GHS-TBT(LF)(SN)_C189892: 插针结构:1x6P;间距:1.25mm;安装方式:立贴;参考系列:GH;总PIN数:6P;排数:1;每排PIN数:6;行距:-;额定电流:1A;触头材质:磷青铜;触头镀层:锡;工作温度:-25℃~+85℃;; LCSC Part Name: 1x6P 间距:1.25mm 立贴 系列:GH; Supplier Part: C189892; Manufacturer: JST; Supplier Footprint: SMD,P=1.25mm; JLCPCB Part Class: Extended Part; Datasheet: https://item.szlcsc.com/datasheet/BM06B-GHS-TBT(LF)(SN)/207057.html; Supplier: LCSC; Pins Structure: 1x6P; Pitch: 1.25mm; Mounting Type: 立贴; Reference Series: GH; Number of Pins: 6P; Number of Rows: 1; Number of PINs Per Row: 6; Current Rating: 1A; Contact Material: 磷青铜; Contact Plating: 锡; Operating Temperature: -25℃~+85℃; Voltage Rating: 50V; Plastic Material: PA9T; Flame Retardant Rating: UL94V-0; Supplementary Features: 辅助焊脚; Color: 白色; Z-Height of the Board: 4.05mm; X-Length of Bottom Edge on Board (Spacing Line): 10.75mm; Y-Width of Bottom Edge on Board: 4.32mm; H7MS_Function: J_SPI3; H7MS_Revision: R4; H7MS_Assembly: FIT
J1002 = BM04B-GHS-TBT(LF)(SN): 插针结构:1x4P;间距:1.25mm;安装方式:立贴;参考系列:GH;总PIN数:4P;排数:1;每排PIN数:4;行距:-;额定电流:1A;触头材质:磷青铜;触头镀层:锡;工作温度:-25℃~+85℃;; LCSC Part Name: 1x4P 间距:1.25mm 立贴 系列:GH; Supplier Part: C161692; Manufacturer: JST; Supplier Footprint: SMD,P=1.25mm; JLCPCB Part Class: Extended Part; Datasheet: https://item.szlcsc.com/datasheet/BM04B-GHS-TBT(LF)(SN)/173073.html; Supplier: LCSC; Pins Structure: 1x4P; Pitch: 1.25mm; Mounting Type: 立贴; Reference Series: GH; Number of Pins: 4P; Number of Rows: 1; Number of PINs Per Row: 4; Current Rating: 1A; Contact Material: 磷青铜; Contact Plating: 锡; Operating Temperature: -25℃~+85℃; Voltage Rating: 50V; Plastic Material: PA9T; Flame Retardant Rating: UL94V-0; Supplementary Features: 辅助焊脚; Color: 白色; Z-Height of the Board: 4.05mm; X-Length of Bottom Edge on Board (Spacing Line): 8.25mm; Y-Width of Bottom Edge on Board: 4.32mm; H7MS_Function: J_I2C2; H7MS_Revision: R4; H7MS_Assembly: FIT
J1003 = 2.54-2*3PLTPZ: 插针结构:2x3P;间距:2.54mm;行距:2.54mm;圆针/方针:方针;安装方式:立贴;排数:双排;总PIN位数:6P;额定电流:3A;配合针长度:6mm;塑高:2.5mm;触头材质:黄铜;触头镀层:金;工作温度:-55℃~+105℃;颜色:黑色;; LCSC Part Name: 2x3P 间距:2.54mm 方针 立贴; Supplier Part: C3152771; Manufacturer: BOOMELE(博穆精密); Supplier Footprint: SMD,P=2.54mm; JLCPCB Part Class: Extended Part; Datasheet: https://item.szlcsc.com/datasheet/2.54-2*3PLTPZ/3714594.html; Supplier: LCSC; Pin Structure: 2x3P; Pitch: 2.54mm; Row Spacing: 2.54mm; Circluar Pins/Square Pins: 方针; Mounting Type: 立贴; Number of Rows: 双排; Number of Pins: 6P; Current Rating: 3A; Length of Mating Pin: 6mm; Insulation Height: 2.5mm; Contact Material: 黄铜; Contact Plating: 金; Operating Temperature: -55℃~+105℃; Color: 黑色; H7MS_Function: J_USER; H7MS_Revision: R4; H7MS_Assembly: FIT
R1001 = RC0402FR-0722RL: 电阻类型:厚膜电阻;阻值:22Ω;精度:±1%;功率:62.5mW;最大工作电压:50V;温度系数:±100ppm/℃;; LCSC Part Name: 厚膜电阻 22Ω ±1% 62.5mW; Supplier Part: C114765; Manufacturer: YAGEO(国巨); Supplier Footprint: 0402; JLCPCB Part Class: Extended Part; Datasheet: https://atta.szlcsc.com/upload/public/pdf/source/20180821/C275644_0D56F95EFF785E7D9A1FEF436B37DA78.pdf; Supplier: LCSC; Type: 厚膜电阻; Tolerance: ±1%; Power(Watts): 62.5mW; Overload Voltage (Max): 50V; Temperature Coefficient: ±100ppm/℃; Operating Temperature Range: -55℃~+155℃; H7MS_Function: R_SPI3_SCK; H7MS_Revision: R4; H7MS_Assembly: FIT
R1002 = RC0402FR-0722RL: 电阻类型:厚膜电阻;阻值:22Ω;精度:±1%;功率:62.5mW;最大工作电压:50V;温度系数:±100ppm/℃;; LCSC Part Name: 厚膜电阻 22Ω ±1% 62.5mW; Supplier Part: C114765; Manufacturer: YAGEO(国巨); Supplier Footprint: 0402; JLCPCB Part Class: Extended Part; Datasheet: https://atta.szlcsc.com/upload/public/pdf/source/20180821/C275644_0D56F95EFF785E7D9A1FEF436B37DA78.pdf; Supplier: LCSC; Type: 厚膜电阻; Tolerance: ±1%; Power(Watts): 62.5mW; Overload Voltage (Max): 50V; Temperature Coefficient: ±100ppm/℃; Operating Temperature Range: -55℃~+155℃; H7MS_Function: R_SPI3_MOSI; H7MS_Revision: R4; H7MS_Assembly: FIT
R1003 = RC0402FR-0722RL: 电阻类型:厚膜电阻;阻值:22Ω;精度:±1%;功率:62.5mW;最大工作电压:50V;温度系数:±100ppm/℃;; LCSC Part Name: 厚膜电阻 22Ω ±1% 62.5mW; Supplier Part: C114765; Manufacturer: YAGEO(国巨); Supplier Footprint: 0402; JLCPCB Part Class: Extended Part; Datasheet: https://atta.szlcsc.com/upload/public/pdf/source/20180821/C275644_0D56F95EFF785E7D9A1FEF436B37DA78.pdf; Supplier: LCSC; Type: 厚膜电阻; Tolerance: ±1%; Power(Watts): 62.5mW; Overload Voltage (Max): 50V; Temperature Coefficient: ±100ppm/℃; Operating Temperature Range: -55℃~+155℃; H7MS_Function: R_SPI3_MISO; H7MS_Revision: R4; H7MS_Assembly: FIT
R1004 = RC0402FR-0722RL: 电阻类型:厚膜电阻;阻值:22Ω;精度:±1%;功率:62.5mW;最大工作电压:50V;温度系数:±100ppm/℃;; LCSC Part Name: 厚膜电阻 22Ω ±1% 62.5mW; Supplier Part: C114765; Manufacturer: YAGEO(国巨); Supplier Footprint: 0402; JLCPCB Part Class: Extended Part; Datasheet: https://atta.szlcsc.com/upload/public/pdf/source/20180821/C275644_0D56F95EFF785E7D9A1FEF436B37DA78.pdf; Supplier: LCSC; Type: 厚膜电阻; Tolerance: ±1%; Power(Watts): 62.5mW; Overload Voltage (Max): 50V; Temperature Coefficient: ±100ppm/℃; Operating Temperature Range: -55℃~+155℃; H7MS_Function: R_SPI3_NSS; H7MS_Revision: R4; H7MS_Assembly: FIT
R1005 = RC0402FR-0722RL: 电阻类型:厚膜电阻;阻值:22Ω;精度:±1%;功率:62.5mW;最大工作电压:50V;温度系数:±100ppm/℃;; LCSC Part Name: 厚膜电阻 22Ω ±1% 62.5mW; Supplier Part: C114765; Manufacturer: YAGEO(国巨); Supplier Footprint: 0402; JLCPCB Part Class: Extended Part; Datasheet: https://atta.szlcsc.com/upload/public/pdf/source/20180821/C275644_0D56F95EFF785E7D9A1FEF436B37DA78.pdf; Supplier: LCSC; Type: 厚膜电阻; Tolerance: ±1%; Power(Watts): 62.5mW; Overload Voltage (Max): 50V; Temperature Coefficient: ±100ppm/℃; Operating Temperature Range: -55℃~+155℃; H7MS_Function: R_I2C2_SCL; H7MS_Revision: R4; H7MS_Assembly: FIT
R1006 = RC0402FR-074K7L: 电阻类型:厚膜电阻;阻值:4.7kΩ;精度:±1%;功率:62.5mW;工作电压:50V;温度系数:±100ppm/℃;; LCSC Part Name: 厚膜电阻 4.7kΩ ±1% 62.5mW; Supplier Part: C105871; Manufacturer: YAGEO(国巨); Supplier Footprint: 0402; JLCPCB Part Class: Extended Part; Datasheet: https://item.szlcsc.com/datasheet/RC0402FR-074K7L/107086.html; Supplier: LCSC; Type: 厚膜电阻; Tolerance: ±1%; Power(Watts): 62.5mW; Voltage-Supply(Max): 50V; Temperature Coefficient: ±100ppm/℃; Operating Temperature: -55℃~+155℃; H7MS_Function: R_I2C2_SCL_PU; H7MS_Revision: R4; H7MS_Assembly: FIT
R1007 = RC0402FR-0722RL: 电阻类型:厚膜电阻;阻值:22Ω;精度:±1%;功率:62.5mW;最大工作电压:50V;温度系数:±100ppm/℃;; LCSC Part Name: 厚膜电阻 22Ω ±1% 62.5mW; Supplier Part: C114765; Manufacturer: YAGEO(国巨); Supplier Footprint: 0402; JLCPCB Part Class: Extended Part; Datasheet: https://atta.szlcsc.com/upload/public/pdf/source/20180821/C275644_0D56F95EFF785E7D9A1FEF436B37DA78.pdf; Supplier: LCSC; Type: 厚膜电阻; Tolerance: ±1%; Power(Watts): 62.5mW; Overload Voltage (Max): 50V; Temperature Coefficient: ±100ppm/℃; Operating Temperature Range: -55℃~+155℃; H7MS_Function: R_I2C2_SDA; H7MS_Revision: R4; H7MS_Assembly: FIT
R1008 = RC0402FR-074K7L: 电阻类型:厚膜电阻;阻值:4.7kΩ;精度:±1%;功率:62.5mW;工作电压:50V;温度系数:±100ppm/℃;; LCSC Part Name: 厚膜电阻 4.7kΩ ±1% 62.5mW; Supplier Part: C105871; Manufacturer: YAGEO(国巨); Supplier Footprint: 0402; JLCPCB Part Class: Extended Part; Datasheet: https://item.szlcsc.com/datasheet/RC0402FR-074K7L/107086.html; Supplier: LCSC; Type: 厚膜电阻; Tolerance: ±1%; Power(Watts): 62.5mW; Voltage-Supply(Max): 50V; Temperature Coefficient: ±100ppm/℃; Operating Temperature: -55℃~+155℃; H7MS_Function: R_I2C2_SDA_PU; H7MS_Revision: R4; H7MS_Assembly: FIT
R1009 = RC0402FR-07100KL: 电阻类型:厚膜电阻;阻值:100kΩ;精度:±1%;功率:62.5mW;工作电压:50V;温度系数:±100ppm/℃;; LCSC Part Name: 厚膜电阻 100kΩ ±1% 62.5mW; Supplier Part: C60491; Manufacturer: YAGEO(国巨); Supplier Footprint: 0402; JLCPCB Part Class: Extended Part; Datasheet: https://item.szlcsc.com/datasheet/RC0402FR-07100KL/61543.html; Supplier: LCSC; Type: 厚膜电阻; Tolerance: ±1%; Power(Watts): 62.5mW; Voltage-Supply(Max): 50V; Temperature Coefficient: ±100ppm/℃; Operating Temperature: -55℃~+155℃; H7MS_Function: R_PORT_FAULT; H7MS_Revision: R4; H7MS_Assembly: FIT
R1010 = RC0402FR-0745K3L: 电阻类型:厚膜电阻;阻值:45.3kΩ;精度:±1%;功率:62.5mW;工作电压:50V;温度系数:±100ppm/℃;; LCSC Part Name: 厚膜电阻 45.3kΩ ±1% 62.5mW; Supplier Part: C137977; Manufacturer: YAGEO(国巨); Supplier Footprint: 0402; JLCPCB Part Class: Extended Part; Datasheet: https://item.szlcsc.com/datasheet/RC0402FR-0745K3L/149293.html; Supplier: LCSC; Type: 厚膜电阻; Tolerance: ±1%; Power(Watts): 62.5mW; Voltage-Supply(Max): 50V; Temperature Coefficient: ±100ppm/℃; Operating Temperature: -55℃~+155℃; H7MS_Function: R_PORT_ILIM; H7MS_Revision: R4; H7MS_Assembly: FIT
R1011 = RC0402JR-070RL: 电阻类型:厚膜电阻;阻值:0Ω;精度:±5%;功率:62.5mW;工作电压:50V;温度系数:-;; LCSC Part Name: 厚膜电阻 0Ω ±5% 62.5mW; Supplier Part: C60485; Manufacturer: YAGEO(国巨); Supplier Footprint: 0402; JLCPCB Part Class: Extended Part; Datasheet: https://item.szlcsc.com/datasheet/RC0402JR-070RL/61537.html; Supplier: LCSC; Type: 厚膜电阻; Tolerance: ±5%; Power(Watts): 62.5mW; Voltage-Supply(Max): 50V; Operating Temperature: -55℃~+155℃; H7MS_Function: R_GPIO_PA0; H7MS_Revision: R4; H7MS_Assembly: FIT
R1012 = RC0402JR-070RL: 电阻类型:厚膜电阻;阻值:0Ω;精度:±5%;功率:62.5mW;工作电压:50V;温度系数:-;; LCSC Part Name: 厚膜电阻 0Ω ±5% 62.5mW; Supplier Part: C60485; Manufacturer: YAGEO(国巨); Supplier Footprint: 0402; JLCPCB Part Class: Extended Part; Datasheet: https://item.szlcsc.com/datasheet/RC0402JR-070RL/61537.html; Supplier: LCSC; Type: 厚膜电阻; Tolerance: ±5%; Power(Watts): 62.5mW; Voltage-Supply(Max): 50V; Operating Temperature: -55℃~+155℃; H7MS_Function: R_GPIO_PA1; H7MS_Revision: R4; H7MS_Assembly: FIT
R1013 = RC0402JR-070RL: 电阻类型:厚膜电阻;阻值:0Ω;精度:±5%;功率:62.5mW;工作电压:50V;温度系数:-;; LCSC Part Name: 厚膜电阻 0Ω ±5% 62.5mW; Supplier Part: C60485; Manufacturer: YAGEO(国巨); Supplier Footprint: 0402; JLCPCB Part Class: Extended Part; Datasheet: https://item.szlcsc.com/datasheet/RC0402JR-070RL/61537.html; Supplier: LCSC; Type: 厚膜电阻; Tolerance: ±5%; Power(Watts): 62.5mW; Voltage-Supply(Max): 50V; Operating Temperature: -55℃~+155℃; H7MS_Function: R_GPIO_PB0; H7MS_Revision: R4; H7MS_Assembly: FIT
R1014 = RC0402JR-070RL: 电阻类型:厚膜电阻;阻值:0Ω;精度:±5%;功率:62.5mW;工作电压:50V;温度系数:-;; LCSC Part Name: 厚膜电阻 0Ω ±5% 62.5mW; Supplier Part: C60485; Manufacturer: YAGEO(国巨); Supplier Footprint: 0402; JLCPCB Part Class: Extended Part; Datasheet: https://item.szlcsc.com/datasheet/RC0402JR-070RL/61537.html; Supplier: LCSC; Type: 厚膜电阻; Tolerance: ±5%; Power(Watts): 62.5mW; Voltage-Supply(Max): 50V; Operating Temperature: -55℃~+155℃; H7MS_Function: R_GPIO_PB1; H7MS_Revision: R4; H7MS_Assembly: FIT
U1001 = TPS2553DBVR-1: 类型:高侧开关;通道数:1;输入控制逻辑:高电平有效;工作电压:2.5V~6.5V;最大连续电流:1.5A;导通电阻:85mΩ;; LCSC Part Name: 精密可调、带电流限制的电源分配开关; Supplier Part: C111738; Manufacturer: TI(德州仪器); Supplier Footprint: SOT-23-6; JLCPCB Part Class: Extended Part; Datasheet: https://www.ti.com/cn/lit/ds/symlink/tps2553-1.pdf; Supplier: LCSC; Type: 高侧开关; Number of Channels: 1; Control Input Logic: 高电平有效; Voltage - Supply: 2.5V~6.5V; Maximum Continuous Current: 1.5A; RDS(on): 85mΩ; Features: 过温保护；过流保护；短路保护；过压保护；集成电荷泵；反向电压保护；反向电流阻断；软启动；锁存保护；欠压锁定; Operating Temperature	-: -40℃~+150℃; H7MS_Function: U_PORT; H7MS_Revision: R4; H7MS_Assembly: FIT

## Nets
3V3_A: TP803.1(TP) ; also on sheet 1 2 5
3V3_AUX: J801.4 J801.29 J802.29 J1001.2 J1002.2 J1003.2 R1006.1 R1008.1 TP804.1(TP) ; also on sheet 3
3V3_D: R1009.1 TP802.1(TP) ; also on sheet 1 2 3 4 5 6 7 11
5V_IN: C1001.1 C1002.1 TP801.1(TP) U1001.1(IN) ; also on sheet 3 5 6 11
5V_PORT: C1003.1 C1004.1 J801.2 J801.28 J901.2 J902.2 J903.2 J906.2 U1001.6(OUT)
GND: C1001.2 C1002.2 C1003.2 C1004.2 D901.3(GND) D902.3(GND) D903.3(GND) D906.3(GND) D1001.3(GND) D1002.3(GND) D1003.3(GND) D1004.3(GND) D1005.3(GND) J801.1 J801.3 J801.7 J801.10 J801.13 J801.16 J801.19 J801.22 J801.25 J801.30 J802.1 J802.4 J802.7 J802.10 J802.16 J802.28 J802.30 J901.1 J901.5 J901.6 J902.1 J902.5 J902.6 J903.1 J903.5 J903.6 J906.1 J906.5 J906.6 J1001.1 J1001.7 J1001.8 J1002.1 J1002.5 J1002.6 J1003.1 R1010.2 TP806.1(TP) U1001.2(GND) ; also on sheet 1 2 3 4 5 6 7 11
AUX_FAULT_N: TP812.1(TP) ; also on sheet 3
BOOT0: TP808.1(TP) ; also on sheet 1 4
BUCK_PG: TP813.1(TP) ; also on sheet 3
CAN1_H: J802.2 ; also on sheet 6
CAN1_L: J802.3 ; also on sheet 6
CAN2_H: J802.5 ; also on sheet 6
CAN2_L: J802.6 ; also on sheet 6
CAN3_H: J802.8 ; also on sheet 6
CAN3_L: J802.9 ; also on sheet 6
EXP_PA0: R1011.1 ; also on sheet 1
EXP_PA1: R1012.1 ; also on sheet 1
EXP_PA2: J802.17 ; also on sheet 1
EXP_PA3: J802.18 ; also on sheet 1
EXP_PA4: J802.19 ; also on sheet 1
EXP_PA8: J802.20 ; also on sheet 1
EXP_PB0: R1013.1 ; also on sheet 1
EXP_PB1: R1014.1 ; also on sheet 1
EXP_PB7: J802.13 ; also on sheet 1
EXP_PB12: J802.21 ; also on sheet 1
EXP_PB13: J802.22 ; also on sheet 1
EXP_PC0: J802.23 ; also on sheet 1
EXP_PC1: J802.24 ; also on sheet 1
EXP_PC4: J802.25 ; also on sheet 1
EXP_PC5: J802.26 ; also on sheet 1
EXP_PC9: J802.27 ; also on sheet 1
EXP_PC10: J802.14 ; also on sheet 1
EXP_PC11: J802.15 ; also on sheet 1
EXP_PD11: J802.12 ; also on sheet 1
EXP_PE10: J802.11 ; also on sheet 1
HEAT_5V: TP811.1(TP) ; also on sheet 5
HEAT_ALLOW: TP810.1(TP) ; also on sheet 5
I2C2_SCL: R1005.1 ; also on sheet 1
I2C2_SCL_CONN: D1003.1(IO1) J1002.3 R1005.2 R1006.2
I2C2_SDA: R1007.1 ; also on sheet 1
I2C2_SDA_CONN: D1003.2(IO2) J1002.4 R1007.2 R1008.2
LPUART1_RX: J801.24 ; also on sheet 1
LPUART1_TX: J801.23 ; also on sheet 1
NRST: J801.26 TP807.1(TP) U1001.3(EN) ; also on sheet 1 4 5
PORT_FAULT_N: J801.27 R1009.2 U1001.4(FAULT#) ; also on sheet 1
PORT_ILIM: R1010.1 U1001.5(ILIM)
SPI3_MISO: R1003.1 ; also on sheet 1
SPI3_MISO_CONN: D1002.1(IO1) J1001.5 R1003.2
SPI3_MOSI: R1002.1 ; also on sheet 1
SPI3_MOSI_CONN: D1001.2(IO2) J1001.4 R1002.2
SPI3_NSS: R1004.1 ; also on sheet 1
SPI3_NSS_CONN: D1002.2(IO2) J1001.6 R1004.2
SPI3_SCK: R1001.1 ; also on sheet 1
SPI3_SCK_CONN: D1001.1(IO1) J1001.3 R1001.2
TEMP_OK: TP809.1(TP) ; also on sheet 5
UART4_RX: J801.6 ; also on sheet 1
UART4_TX: J801.5 ; also on sheet 1
UART5_RX: J801.9 ; also on sheet 1
UART5_TX: J801.8 ; also on sheet 1
UART7_RX: J801.12 ; also on sheet 1
UART7_TX: J801.11 ; also on sheet 1
UART8_RX: J801.15 ; also on sheet 1
UART8_TX: J801.14 ; also on sheet 1
UART9_RX: J801.18 ; also on sheet 1
UART9_TX: J801.17 ; also on sheet 1
USART1_RX: R902.1 ; also on sheet 1
USART1_RX_CONN: D901.2(IO2) J901.4 R902.2
USART1_TX: R901.1 ; also on sheet 1
USART1_TX_CONN: D901.1(IO1) J901.3 R901.2
USART2_RX: R904.1 ; also on sheet 1
USART2_RX_CONN: D902.2(IO2) J902.4 R904.2
USART2_TX: R903.1 ; also on sheet 1
USART2_TX_CONN: D902.1(IO1) J902.3 R903.2
USART3_RX: R906.1 ; also on sheet 1
USART3_RX_CONN: D903.2(IO2) J903.4 R906.2
USART3_TX: R905.1 ; also on sheet 1
USART3_TX_CONN: D903.1(IO1) J903.3 R905.2
USART6_RX: R912.1 ; also on sheet 1
USART6_RX_CONN: D906.2(IO2) J906.4 R912.2
USART6_TX: R911.1 ; also on sheet 1
USART6_TX_CONN: D906.1(IO1) J906.3 R911.2
USART10_RX: J801.21 ; also on sheet 1
USART10_TX: J801.20 ; also on sheet 1
USER_PA0: D1004.1(IO1) J1003.3 R1011.2
USER_PA1: D1004.2(IO2) J1003.4 R1012.2
USER_PB0: D1005.1(IO1) J1003.5 R1013.2
USER_PB1: D1005.2(IO2) J1003.6 R1014.2
VCORE: TP805.1(TP) ; also on sheet 1 2

## Notes on the sheets
sheet 8
- C07_板间连接器与测试点
- C07_板间连接器与测试点
- 板间连接器 / 电源与信号测试点
- 板间连接器 / 电源与信号测试点
- 板间连接器 / 电源与信号测试点
- 板间连接器 / 电源与信号测试点
- J801 / 电源与 CAN
- J802 / 可复用 GPIO
- 测试点 / 无钢网开口
- J801 / 7 组串口 / 电源与复位
- J802 / CAN / 其余可复用 GPIO
- 测试点 / 无钢网开口
- J801：电源 / 三路 CAN / 可复用 GPIO
- J801：电源 / 三路 CAN / 可复用 GPIO
- J801：电源 / 三路 CAN / 可复用 GPIO
- J801：电源 / 三路 CAN / 可复用 GPIO
- J802：可复用 GPIO / 地回流
- J802：可复用 GPIO / 地回流
- J802：可复用 GPIO / 地回流
- J802：可复用 GPIO / 地回流
- 核心板在下：TOP = TFM-115-02-L-D-A
  扩展板在上：BOTTOM = SFM-115-02-L-D-A-K-TR
  两组 30pin；装配方向与旧版相反；禁止沿用旧 50pin 针序
  5V_PORT 与 3V3_AUX 均为受限流保护的输出，不接外部电源
- 测试点：0.8 mm 裸铜，开阻焊，不开锡膏
- 测试点：0.8 mm 裸铜，开阻焊，不开锡膏
- 测试点：0.8 mm 裸铜，开阻焊，不开锡膏
- 测试点：0.8 mm 裸铜，开阻焊，不开锡膏
sheet 9
- C08_四组UART直立接口
- C08_四组UART直立接口
- C08_四组UART直立接口
- C08_四组UART直立接口
- C08_四组UART直立接口
- C08_四组UART直立接口
- USART1 / 3.3V UART / GH1.25 直立
- USART1 / 3.3V UART / GH1.25 直立
- USART1 / 3.3V UART / GH1.25 直立
- USART1 / 3.3V UART / GH1.25 直立
- USART1 / 3.3V UART / GH1.25 直立
- USART1 / 3.3V UART / GH1.25 直立
- USART2 / 3.3V UART / GH1.25 直立
- USART2 / 3.3V UART / GH1.25 直立
- USART2 / 3.3V UART / GH1.25 直立
- USART2 / 3.3V UART / GH1.25 直立
- USART2 / 3.3V UART / GH1.25 直立
- USART2 / 3.3V UART / GH1.25 直立
- USART3 / 3.3V UART / GH1.25 直立
- USART3 / 3.3V UART / GH1.25 直立
- USART3 / 3.3V UART / GH1.25 直立
- USART3 / 3.3V UART / GH1.25 直立
- USART3 / 3.3V UART / GH1.25 直立
- USART3 / 3.3V UART / GH1.25 直立
- USART6 / 3.3V UART / GH1.25 直立
- USART6 / 3.3V UART / GH1.25 直立
- USART6 / 3.3V UART / GH1.25 直立
- USART6 / 3.3V UART / GH1.25 直立
- USART6 / 3.3V UART / GH1.25 直立
- USART6 / 3.3V UART / GH1.25 直立
- 四针统一：1 GND / 2 +5V_PORT / 3 MCU_TX / 4 MCU_RX；外部设备 TX/RX 交叉接线
  5V_PORT 由所有核心 UART 与扩展板共同分配，连续负载预算 400mA，总限流详见 C09
  UART4/5/7/8/9、USART10、LPUART1 从 J801 送往上层扩展板
- 四针统一：1 GND / 2 +5V_PORT / 3 MCU_TX / 4 MCU_RX；外部设备 TX/RX 交叉接线
  5V_PORT 由所有核心 UART 与扩展板共同分配，连续负载预算 400mA，总限流详见 C09
  UART4/5/7/8/9、USART10、LPUART1 从 J801 送往上层扩展板
- 四针统一：1 GND / 2 +5V_PORT / 3 MCU_TX / 4 MCU_RX；外部设备 TX/RX 交叉接线
  5V_PORT 由所有核心 UART 与扩展板共同分配，连续负载预算 400mA，总限流详见 C09
  UART4/5/7/8/9、USART10、LPUART1 从 J801 送往上层扩展板
- 四针统一：1 GND / 2 +5V_PORT / 3 MCU_TX / 4 MCU_RX；外部设备 TX/RX 交叉接线
  5V_PORT 由所有核心 UART 与扩展板共同分配，连续负载预算 400mA，总限流详见 C09
  UART4/5/7/8/9、USART10、LPUART1 从 J801 送往上层扩展板
- 四针统一：1 GND / 2 +5V_PORT / 3 MCU_TX / 4 MCU_RX；外部设备 TX/RX 交叉接线
  5V_PORT 由所有核心 UART 与扩展板共同分配，连续负载预算 400mA，总限流详见 C09
  UART4/5/7/8/9、USART10、LPUART1 从 J801 送往上层扩展板
- 四针统一：1 GND / 2 +5V_PORT / 3 MCU_TX / 4 MCU_RX；外部设备 TX/RX 交叉接线
  5V_PORT 由所有核心 UART 与扩展板共同分配，连续负载预算 400mA，总限流详见 C09
  UART4/5/7/8/9、USART10、LPUART1 从 J801 送往上层扩展板
sheet 10
- C09_SPI_I2C自定义排针与接口供电
- C09_SPI_I2C自定义排针与接口供电
- C09_SPI_I2C自定义排针与接口供电
- C09_SPI_I2C自定义排针与接口供电
- C09_SPI_I2C自定义排针与接口供电
- SPI3 / 3.3V / 六针 GH
- SPI3 / 3.3V / 六针 GH
- SPI3 / 3.3V / 六针 GH
- SPI3 / 3.3V / 六针 GH
- SPI3 / 3.3V / 六针 GH
- I2C2 / 3.3V / 四针 GH
- I2C2 / 3.3V / 四针 GH
- I2C2 / 3.3V / 四针 GH
- I2C2 / 3.3V / 四针 GH
- I2C2 / 3.3V / 四针 GH
- 1 GND / 2 3V3_AUX / 3 SCK
  4 MOSI / 5 MISO / 6 NSS
- 1 GND / 2 3V3_AUX / 3 SCK
  4 MOSI / 5 MISO / 6 NSS
- 1 GND / 2 3V3_AUX / 3 SCK
  4 MOSI / 5 MISO / 6 NSS
- 1 GND / 2 3V3_AUX / 3 SCK
  4 MOSI / 5 MISO / 6 NSS
- 1 GND / 2 3V3_AUX / 3 SCK
  4 MOSI / 5 MISO / 6 NSS
- 1 GND / 2 3V3_AUX / 3 SCL / 4 SDA
  4.7k 上拉；外部重复上拉需合并计算
  AUX 关断时停用总线，禁用内部上拉
- 1 GND / 2 3V3_AUX / 3 SCL / 4 SDA
  4.7k 上拉；外部重复上拉需合并计算
  AUX 关断时停用总线，禁用内部上拉
- 1 GND / 2 3V3_AUX / 3 SCL / 4 SDA
  4.7k 上拉；外部重复上拉需合并计算
  AUX 关断时停用总线，禁用内部上拉
- 1 GND / 2 3V3_AUX / 3 SCL / 4 SDA
  4.7k 上拉；外部重复上拉需合并计算
  AUX 关断时停用总线，禁用内部上拉
- 1 GND / 2 3V3_AUX / 3 SCL / 4 SDA
  4.7k 上拉；外部重复上拉需合并计算
  AUX 关断时停用总线，禁用内部上拉
- 5V_PORT 共享限流 / 故障锁存
- 5V_PORT 共享限流 / 故障锁存
- 5V_PORT 共享限流 / 故障锁存
- 5V_PORT 共享限流 / 故障锁存
- 5V_PORT 共享限流 / 故障锁存
- 自定义 GPIO / 2x3 直立排针 / 2.54mm
- 自定义 GPIO / 2x3 直立排针 / 2.54mm
- 自定义 GPIO / 2x3 直立排针 / 2.54mm
- 自定义 GPIO / 2x3 直立排针 / 2.54mm
- 自定义 GPIO / 2x3 直立排针 / 2.54mm
- 1 GND / 2 3V3_AUX / 3 PA0 / 4 PA1 / 5 PB0 / 6 PB1
  四路均可配置 GPIO；ADC/PWM 复用由固件决定
  0Ω 用于隔离/测量；不得接入 5V、12V、24V 或 48V
- 1 GND / 2 3V3_AUX / 3 PA0 / 4 PA1 / 5 PB0 / 6 PB1
  四路均可配置 GPIO；ADC/PWM 复用由固件决定
  0Ω 用于隔离/测量；不得接入 5V、12V、24V 或 48V
- 1 GND / 2 3V3_AUX / 3 PA0 / 4 PA1 / 5 PB0 / 6 PB1
  四路均可配置 GPIO；ADC/PWM 复用由固件决定
  0Ω 用于隔离/测量；不得接入 5V、12V、24V 或 48V
- 1 GND / 2 3V3_AUX / 3 PA0 / 4 PA1 / 5 PB0 / 6 PB1
  四路均可配置 GPIO；ADC/PWM 复用由固件决定
  0Ω 用于隔离/测量；不得接入 5V、12V、24V 或 48V
- 1 GND / 2 3V3_AUX / 3 PA0 / 4 PA1 / 5 PB0 / 6 PB1
  四路均可配置 GPIO；ADC/PWM 复用由固件决定
  0Ω 用于隔离/测量；不得接入 5V、12V、24V 或 48V
- NRST 低时关断；故障锁存后复位核心板重试
  45.3k ILIM；外部连续预算 400mA
  PORT_FAULT_N → PE6，并引至扩展板
- NRST 低时关断；故障锁存后复位核心板重试
  45.3k ILIM；外部连续预算 400mA
  PORT_FAULT_N → PE6，并引至扩展板
- NRST 低时关断；故障锁存后复位核心板重试
  45.3k ILIM；外部连续预算 400mA
  PORT_FAULT_N → PE6，并引至扩展板
- NRST 低时关断；故障锁存后复位核心板重试
  45.3k ILIM；外部连续预算 400mA
  PORT_FAULT_N → PE6，并引至扩展板
- NRST 低时关断；故障锁存后复位核心板重试
  45.3k ILIM；外部连续预算 400mA
  PORT_FAULT_N → PE6，并引至扩展板
